# Altium project EVT_SYS_CARRIER_CI614.PrjPcb
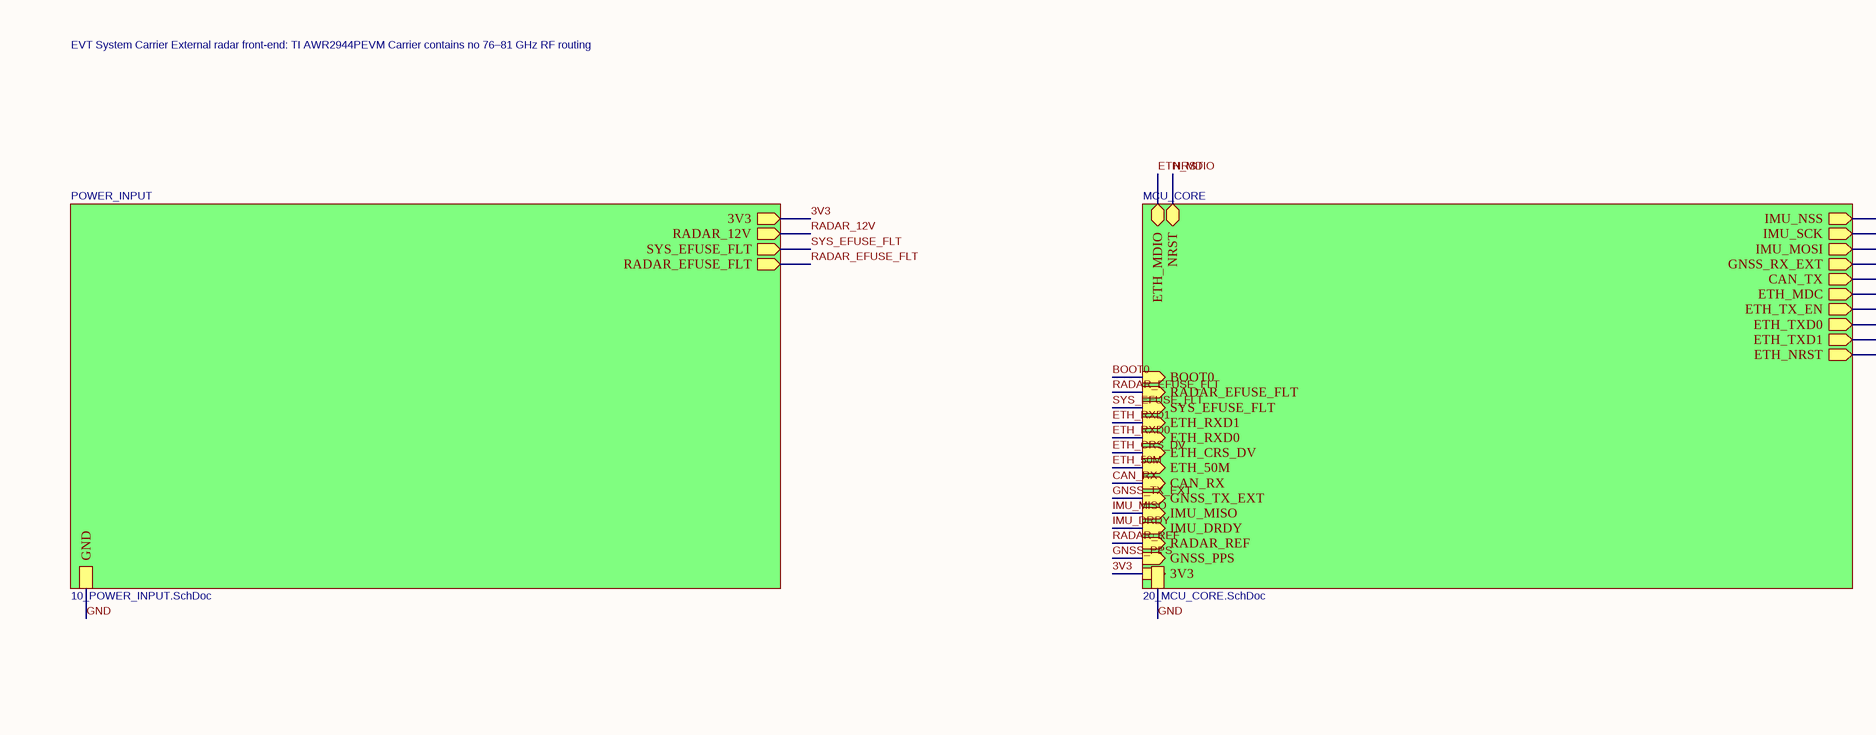
[diagram p0: EVT_SYS_CARRIER.SchDoc, top left]
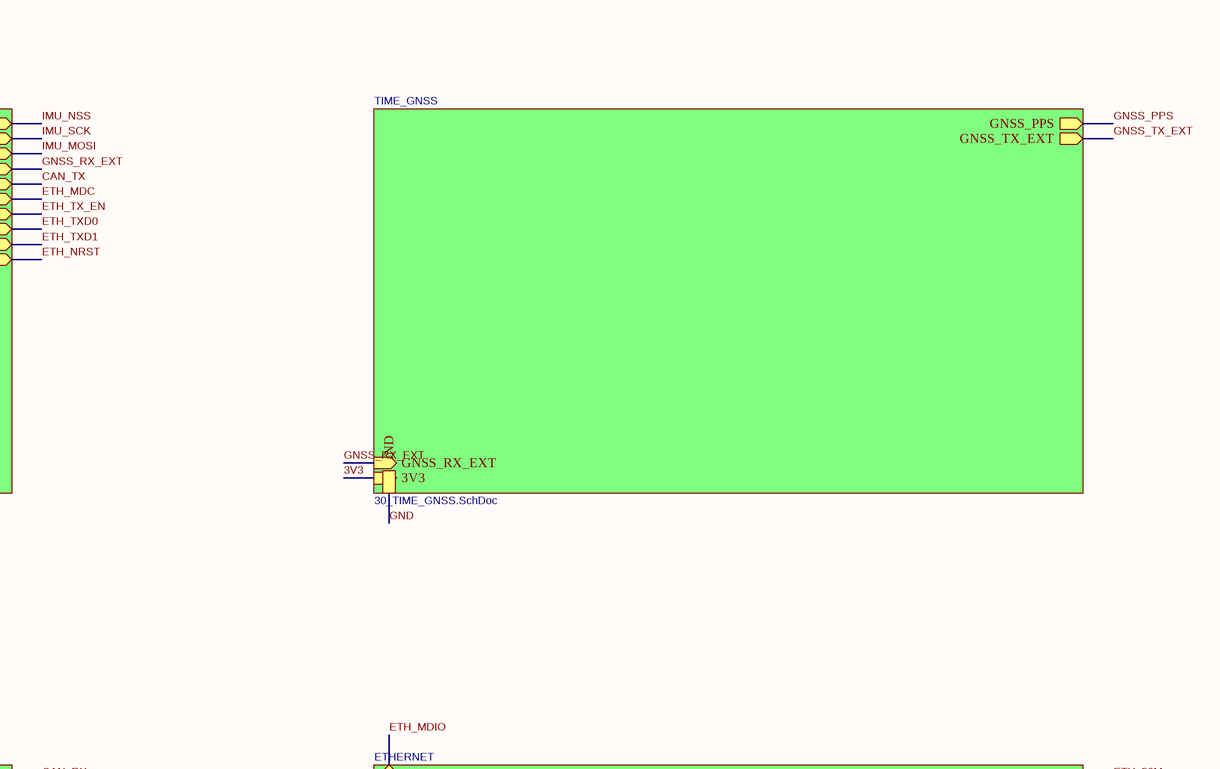
[diagram p1: EVT_SYS_CARRIER.SchDoc, top right]
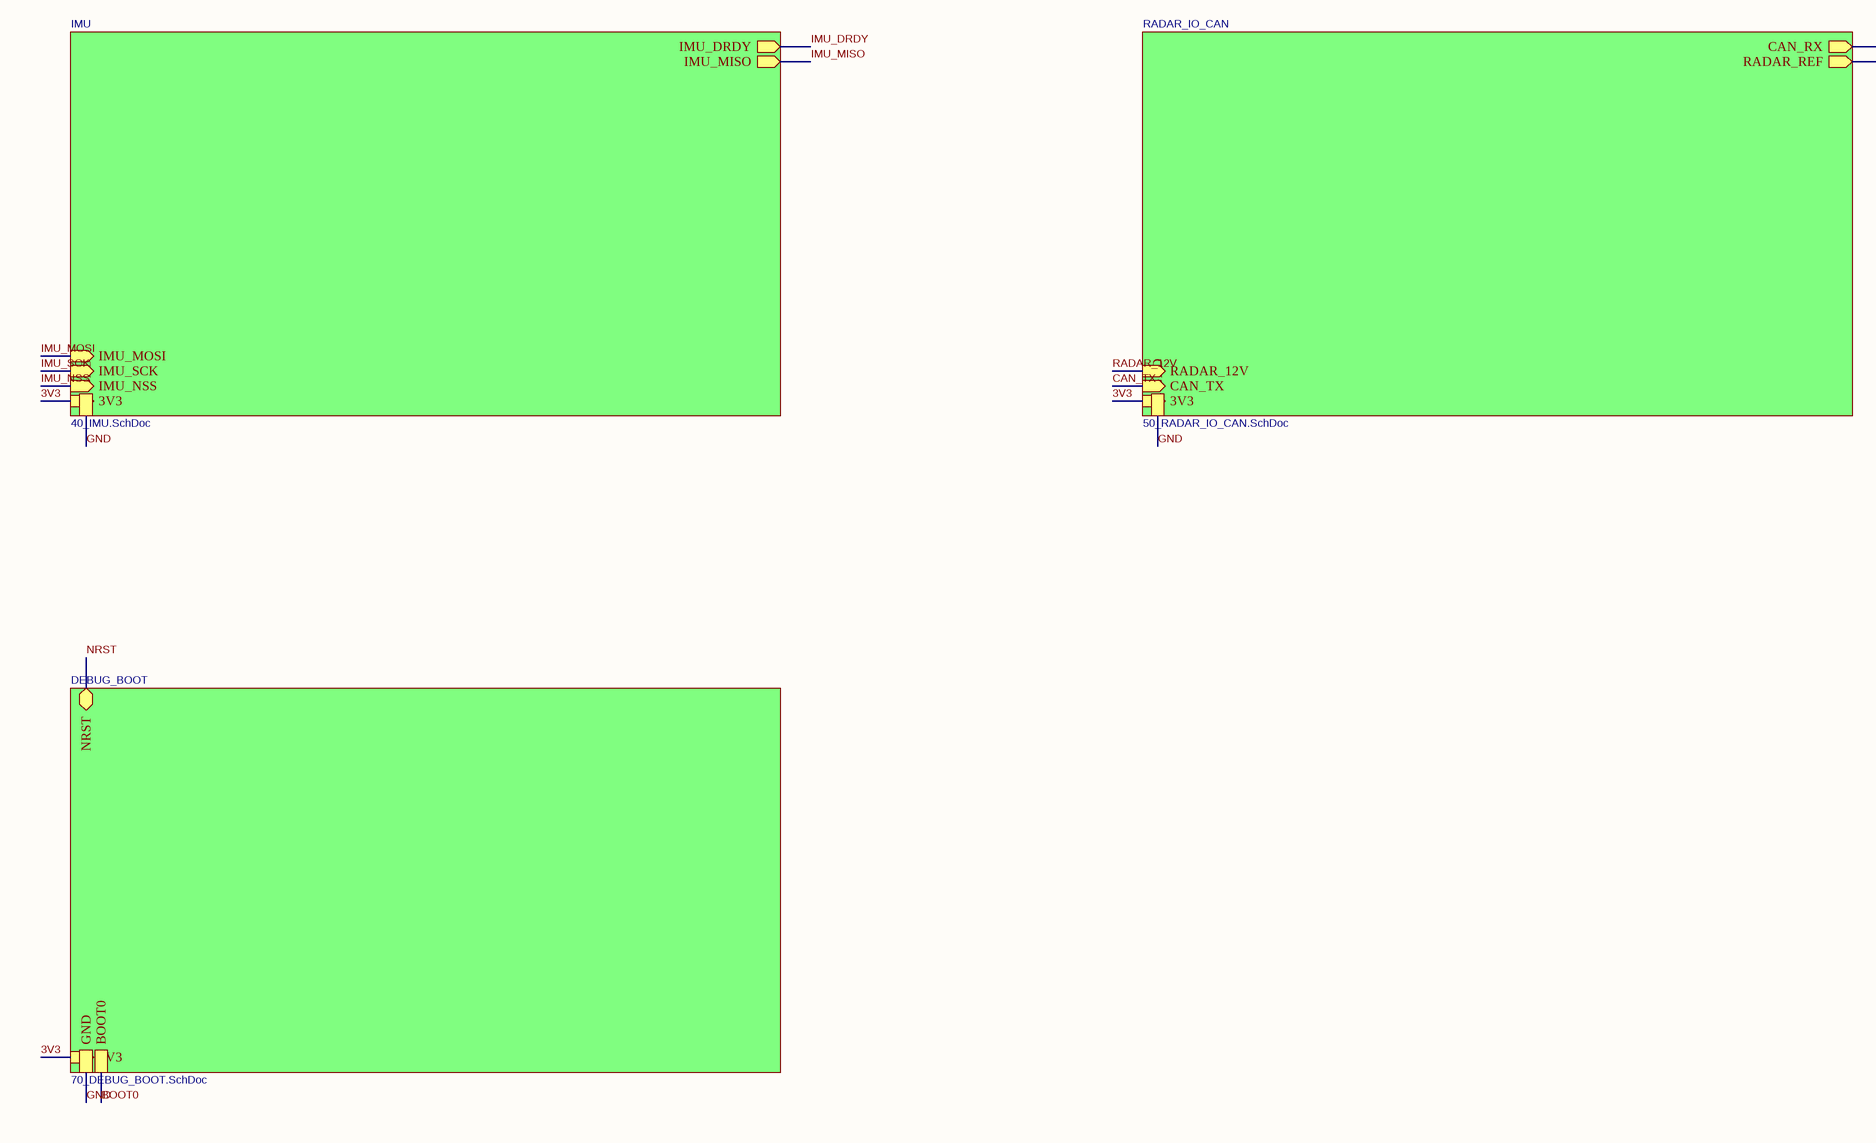
[diagram p2: EVT_SYS_CARRIER.SchDoc, bottom left]
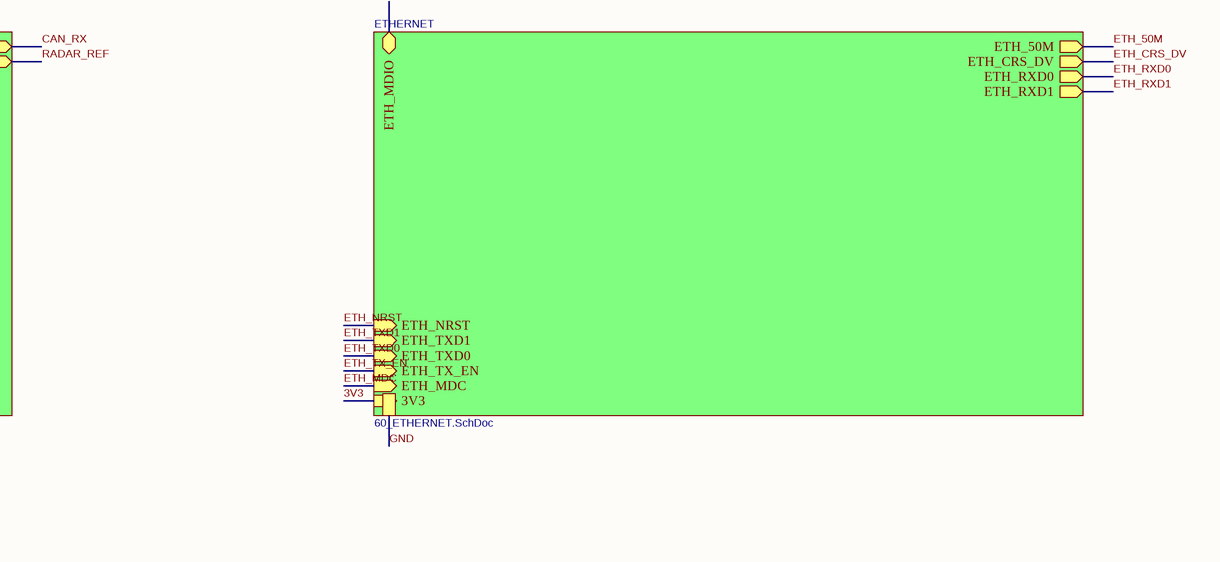
[diagram p3: EVT_SYS_CARRIER.SchDoc, bottom right]
8 sheets, 100 parts. Net scope: hierarchical (ports join the sheet entries above them; power ports are global).
Board file: EVT_SYS_CARRIER.PcbDoc
Sheets:
  EVT_SYS_CARRIER.SchDoc
    POWER_INPUT = 10_POWER_INPUT.SchDoc
    MCU_CORE = 20_MCU_CORE.SchDoc
    TIME_GNSS = 30_TIME_GNSS.SchDoc
    IMU = 40_IMU.SchDoc
    RADAR_IO_CAN = 50_RADAR_IO_CAN.SchDoc
    ETHERNET = 60_ETHERNET.SchDoc
    DEBUG_BOOT = 70_DEBUG_BOOT.SchDoc

## Sheet EVT_SYS_CARRIER.SchDoc
size 594 x 420 mm

### Sub-sheets
DEBUG_BOOT = 70_DEBUG_BOOT.SchDoc: 3V3 (in), GND, NRST (bidir), BOOT0
ETHERNET = 60_ETHERNET.SchDoc: 3V3 (in), GND, ETH_50M (out), ETH_MDIO (bidir), ETH_MDC (in), ETH_CRS_DV (out), ETH_RXD0 (out), ETH_RXD1 (out), ETH_TX_EN (in), ETH_TXD0 (in), ETH_TXD1 (in), ETH_NRST (in)
IMU = 40_IMU.SchDoc: 3V3 (in), GND, IMU_DRDY (out), IMU_NSS (in), IMU_SCK (in), IMU_MISO (out), IMU_MOSI (in)
MCU_CORE = 20_MCU_CORE.SchDoc: 3V3 (in), GND, GNSS_PPS (in), RADAR_REF (in), IMU_DRDY (in), IMU_NSS (out), IMU_SCK (out), IMU_MISO (in), IMU_MOSI (out), GNSS_RX_EXT (out), GNSS_TX_EXT (in), CAN_RX (in), CAN_TX (out), ETH_50M (in), ETH_MDIO (bidir), ETH_MDC (out), ETH_CRS_DV (in), ETH_RXD0 (in), ETH_RXD1 (in), ETH_TX_EN (out), ETH_TXD0 (out), ETH_TXD1 (out), ETH_NRST (out), SYS_EFUSE_FLT (in), RADAR_EFUSE_FLT (in), NRST (bidir), BOOT0 (in)
POWER_INPUT = 10_POWER_INPUT.SchDoc: 3V3 (out), RADAR_12V (out), SYS_EFUSE_FLT (out), RADAR_EFUSE_FLT (out), GND
RADAR_IO_CAN = 50_RADAR_IO_CAN.SchDoc: 3V3 (in), GND, CAN_TX (in), CAN_RX (out), RADAR_REF (out), RADAR_12V (in)
TIME_GNSS = 30_TIME_GNSS.SchDoc: 3V3 (in), GND, GNSS_PPS (out), GNSS_TX_EXT (out), GNSS_RX_EXT (in)

### Nets
3V3: sheet POWER_INPUT/3V3, sheet MCU_CORE/3V3, sheet TIME_GNSS/3V3, sheet IMU/3V3, sheet RADAR_IO_CAN/3V3, sheet ETHERNET/3V3, sheet DEBUG_BOOT/3V3
BOOT0: sheet MCU_CORE/BOOT0, sheet DEBUG_BOOT/BOOT0
CAN_RX: sheet MCU_CORE/CAN_RX, sheet RADAR_IO_CAN/CAN_RX
CAN_TX: sheet MCU_CORE/CAN_TX, sheet RADAR_IO_CAN/CAN_TX
ETH_50M: sheet MCU_CORE/ETH_50M, sheet ETHERNET/ETH_50M
ETH_CRS_DV: sheet MCU_CORE/ETH_CRS_DV, sheet ETHERNET/ETH_CRS_DV
ETH_MDC: sheet MCU_CORE/ETH_MDC, sheet ETHERNET/ETH_MDC
ETH_MDIO: sheet MCU_CORE/ETH_MDIO, sheet ETHERNET/ETH_MDIO
ETH_NRST: sheet MCU_CORE/ETH_NRST, sheet ETHERNET/ETH_NRST
ETH_RXD0: sheet MCU_CORE/ETH_RXD0, sheet ETHERNET/ETH_RXD0
ETH_RXD1: sheet MCU_CORE/ETH_RXD1, sheet ETHERNET/ETH_RXD1
ETH_TX_EN: sheet MCU_CORE/ETH_TX_EN, sheet ETHERNET/ETH_TX_EN
ETH_TXD0: sheet MCU_CORE/ETH_TXD0, sheet ETHERNET/ETH_TXD0
ETH_TXD1: sheet MCU_CORE/ETH_TXD1, sheet ETHERNET/ETH_TXD1
GND: sheet POWER_INPUT/GND, sheet MCU_CORE/GND, sheet TIME_GNSS/GND, sheet IMU/GND, sheet RADAR_IO_CAN/GND, sheet ETHERNET/GND, sheet DEBUG_BOOT/GND
GNSS_PPS: sheet MCU_CORE/GNSS_PPS, sheet TIME_GNSS/GNSS_PPS
GNSS_RX_EXT: sheet MCU_CORE/GNSS_RX_EXT, sheet TIME_GNSS/GNSS_RX_EXT
GNSS_TX_EXT: sheet MCU_CORE/GNSS_TX_EXT, sheet TIME_GNSS/GNSS_TX_EXT
IMU_DRDY: sheet MCU_CORE/IMU_DRDY, sheet IMU/IMU_DRDY
IMU_MISO: sheet MCU_CORE/IMU_MISO, sheet IMU/IMU_MISO
IMU_MOSI: sheet MCU_CORE/IMU_MOSI, sheet IMU/IMU_MOSI
IMU_NSS: sheet MCU_CORE/IMU_NSS, sheet IMU/IMU_NSS
IMU_SCK: sheet MCU_CORE/IMU_SCK, sheet IMU/IMU_SCK
NRST: sheet MCU_CORE/NRST, sheet DEBUG_BOOT/NRST
RADAR_12V: sheet POWER_INPUT/RADAR_12V, sheet RADAR_IO_CAN/RADAR_12V
RADAR_EFUSE_FLT: sheet POWER_INPUT/RADAR_EFUSE_FLT, sheet MCU_CORE/RADAR_EFUSE_FLT
RADAR_REF: sheet MCU_CORE/RADAR_REF, sheet RADAR_IO_CAN/RADAR_REF
SYS_EFUSE_FLT: sheet POWER_INPUT/SYS_EFUSE_FLT, sheet MCU_CORE/SYS_EFUSE_FLT

### Notes on the sheet
- EVT System Carrier
  External radar front-end: TI AWR2944PEVM
  Carrier contains no 76–81 GHz RF routing
- 1
- 2
- 3
- 4
- 5
- 6
- 7
- 8
- 9
- 10
- 11
- A
- B
- C
- D
- E
- F
- G
- H
- Title: EVT_SYS_CARRIER
- File: EVT_SYS_CARRIER.kicad_sch
- Sheet: /
- KiCad E.D.A.  kicad (5.1.4)-1
- Size: A2
- Date:
- Rev:
- Id: 1/1

## Sheet 10_POWER_INPUT.SchDoc
size 297 x 209 mm
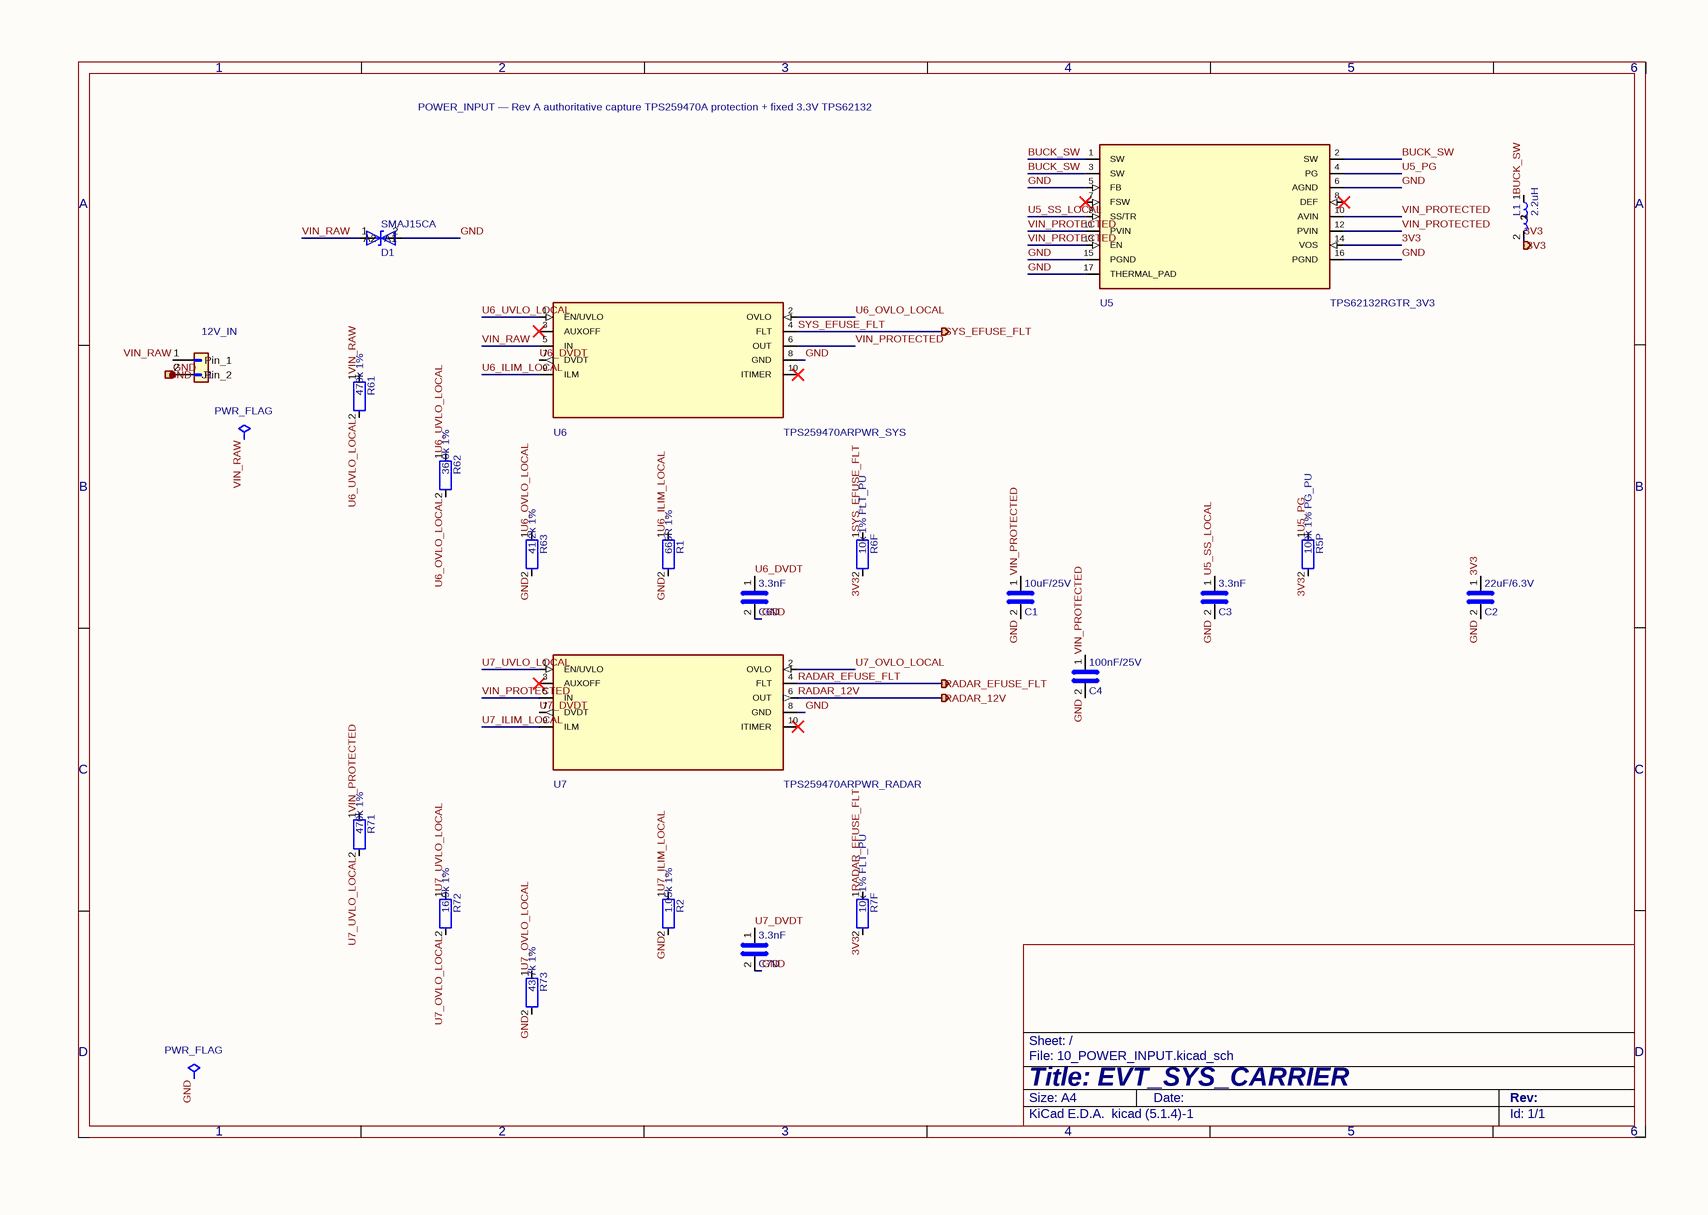
[diagram p4: 10_POWER_INPUT.SchDoc]

### Parts
#FLG0201  PWR_FLAG  (graphical)
#FLG0202  PWR_FLAG  (graphical)
C1  10uF/25V  [C_1206_3216Metric]
C2  22uF/6.3V  [C_1206_3216Metric]
C3  3.3nF  [C_0603_1608Metric]
C4  100nF/25V  [C_0603_1608Metric]
C6D  3.3nF  [C_0603_1608Metric]
C7D  3.3nF  [C_0603_1608Metric]
D1  SMAJ15CA  [D_SMA]
J1  12V_IN  [Molex_43650-0200_RA_THT_2P]
L1  2.2uH  [Coilcraft_XFL4020_4x4]
R1  665R 1%  [R_0603_1608Metric]
R2  1.05k 1%  [R_0603_1608Metric]
R5P  100k 1% PG_PU  [R_0603_1608Metric]
R6F  10k 1% FLT_PU  [R_0603_1608Metric]
R7F  10k 1% FLT_PU  [R_0603_1608Metric]
R61  470k 1%  [R_0603_1608Metric]
R62  36.0k 1%  [R_0603_1608Metric]
R63  41.2k 1%  [R_0603_1608Metric]
R71  470k 1%  [R_0603_1608Metric]
R72  16.9k 1%  [R_0603_1608Metric]
R73  43.7k 1%  [R_0603_1608Metric]
U5  TPS62132RGTR_3V3  [VQFN-16-1EP_3x3mm_P0.5mm_EP1.68x1.68mm]
U6  TPS259470ARPWR_SYS  [TPS259470A_RPW0010A_VQFN-HR-10_2x2mm_P0.475mm]
U7  TPS259470ARPWR_RADAR  [TPS259470A_RPW0010A_VQFN-HR-10_2x2mm_P0.475mm]

### Ports
3V3 (out), GND, RADAR_12V (out), RADAR_EFUSE_FLT (out), SYS_EFUSE_FLT (out)

### Nets
3V3: C2.1 L1.2 R5P.2 R6F.2 R7F.2 U5.14(VOS) ; port 3V3
BUCK_SW: L1.1 U5.1(SW) U5.2(SW) U5.3(SW)
GND: #FLG0202.1 C1.2 C2.2 C3.2 C4.2 C6D.2 C7D.2 D1.2(A2) J1.2(Pin_2) R1.2 R2.2 R63.2 R73.2 U5.5(FB) U5.6(AGND) U5.15(PGND) U5.16(PGND) U5.17(THERMAL_PAD) U6.8(GND) U7.8(GND) ; port GND
RADAR_12V: U7.6(OUT) ; port RADAR_12V
RADAR_EFUSE_FLT: R7F.1 U7.4(FLT) ; port RADAR_EFUSE_FLT
SYS_EFUSE_FLT: R6F.1 U6.4(FLT) ; port SYS_EFUSE_FLT
U5_PG: R5P.1 U5.4(PG)
U5_SS_LOCAL: C3.1 U5.9(SS/TR)
U6_DVDT: C6D.1 U6.7(DVDT)
U6_ILIM_LOCAL: R1.1 U6.9(ILM)
U6_OVLO_LOCAL: R62.2 R63.1 U6.2(OVLO)
U6_UVLO_LOCAL: R61.2 R62.1 U6.1(EN/UVLO)
U7_DVDT: C7D.1 U7.7(DVDT)
U7_ILIM_LOCAL: R2.1 U7.9(ILM)
U7_OVLO_LOCAL: R72.2 R73.1 U7.2(OVLO)
U7_UVLO_LOCAL: R71.2 R72.1 U7.1(EN/UVLO)
VIN_PROTECTED: C1.1 C4.1 R71.1 U5.10(AVIN) U5.11(PVIN) U5.12(PVIN) U5.13(EN) U6.6(OUT) U7.5(IN)
VIN_RAW: #FLG0201.1 D1.1(A1) J1.1(Pin_1) R61.1 U6.5(IN)

Not connected (* = marked no-connect by the designer): U5 7(FSW)* 8(DEF)*; U6 3(AUXOFF)* 10(ITIMER)*; U7 3(AUXOFF)* 10(ITIMER)*

### Notes on the sheet
- POWER_INPUT — Rev A authoritative capture
  TPS259470A protection + fixed 3.3V TPS62132
- 1
- 2
- 3
- 4
- 5
- 6
- A
- B
- C
- D
- Title: EVT_SYS_CARRIER
- File: 10_POWER_INPUT.kicad_sch
- Sheet: /
- KiCad E.D.A.  kicad (5.1.4)-1
- Size: A4
- Date:
- Rev:
- Id: 1/1

### Library data of the parts
#FLG0201 #FLG0202 = PWR_FLAG: hierarchy_path: /6b16e5b2-f68a-4a25-ac1d-30b3be7dfe00/26a33be1-548c-4698-a3f3-a2473fb4ee95; Value: PWR_FLAG
C1 = C: MPN: 10uF_25V_X7R; hierarchy_path: /6b16e5b2-f68a-4a25-ac1d-30b3be7dfe00/26a33be1-548c-4698-a3f3-a2473fb4ee95; Value: 10uF/25V; Footprint: Capacitor_SMD:C_1206_3216Metric
C2 = C: MPN: 22uF_6.3V_X7R; hierarchy_path: /6b16e5b2-f68a-4a25-ac1d-30b3be7dfe00/26a33be1-548c-4698-a3f3-a2473fb4ee95; Value: 22uF/6.3V; Footprint: Capacitor_SMD:C_1206_3216Metric
C3 C6D C7D = C: MPN: 3.3nF_X7R; hierarchy_path: /6b16e5b2-f68a-4a25-ac1d-30b3be7dfe00/26a33be1-548c-4698-a3f3-a2473fb4ee95; Value: 3.3nF; Footprint: Capacitor_SMD:C_0603_1608Metric
C4 = C: MPN: 100nF_25V_X7R; hierarchy_path: /6b16e5b2-f68a-4a25-ac1d-30b3be7dfe00/26a33be1-548c-4698-a3f3-a2473fb4ee95; Value: 100nF/25V; Footprint: Capacitor_SMD:C_0603_1608Metric
D1 = D_TVS: hierarchy_path: /6b16e5b2-f68a-4a25-ac1d-30b3be7dfe00/26a33be1-548c-4698-a3f3-a2473fb4ee95; MPN: SMAJ15CA; Value: SMAJ15CA; Footprint: Diode_SMD:D_SMA
J1 = Conn_01x02: MPN: 43650-0200; hierarchy_path: /6b16e5b2-f68a-4a25-ac1d-30b3be7dfe00/26a33be1-548c-4698-a3f3-a2473fb4ee95; Value: 12V_IN; Footprint: SystemCarrier_Altium:Molex_43650-0200_RA_THT_2P
L1 = L: MPN: XFL4020-222MEC; hierarchy_path: /6b16e5b2-f68a-4a25-ac1d-30b3be7dfe00/26a33be1-548c-4698-a3f3-a2473fb4ee95; Value: 2.2uH; Footprint: SystemCarrier_Altium:Coilcraft_XFL4020_4x4
R1 = R: MPN: 665R_1%; hierarchy_path: /6b16e5b2-f68a-4a25-ac1d-30b3be7dfe00/26a33be1-548c-4698-a3f3-a2473fb4ee95; Value: 665R 1%; Footprint: Resistor_SMD:R_0603_1608Metric
R2 = R: MPN: 1.05k_1%; hierarchy_path: /6b16e5b2-f68a-4a25-ac1d-30b3be7dfe00/26a33be1-548c-4698-a3f3-a2473fb4ee95; Value: 1.05k 1%; Footprint: Resistor_SMD:R_0603_1608Metric
R5P = R: MPN: 100k_1%; hierarchy_path: /6b16e5b2-f68a-4a25-ac1d-30b3be7dfe00/26a33be1-548c-4698-a3f3-a2473fb4ee95; Value: 100k 1% PG_PU; Footprint: Resistor_SMD:R_0603_1608Metric
R6F R7F = R: MPN: 10k_1%; hierarchy_path: /6b16e5b2-f68a-4a25-ac1d-30b3be7dfe00/26a33be1-548c-4698-a3f3-a2473fb4ee95; Value: 10k 1% FLT_PU; Footprint: Resistor_SMD:R_0603_1608Metric
R61 R71 = R: MPN: 470k_1%; hierarchy_path: /6b16e5b2-f68a-4a25-ac1d-30b3be7dfe00/26a33be1-548c-4698-a3f3-a2473fb4ee95; Value: 470k 1%; Footprint: Resistor_SMD:R_0603_1608Metric
R62 = R: MPN: 36.0k_1%; hierarchy_path: /6b16e5b2-f68a-4a25-ac1d-30b3be7dfe00/26a33be1-548c-4698-a3f3-a2473fb4ee95; Value: 36.0k 1%; Footprint: Resistor_SMD:R_0603_1608Metric
R63 = R: MPN: 41.2k_1%; hierarchy_path: /6b16e5b2-f68a-4a25-ac1d-30b3be7dfe00/26a33be1-548c-4698-a3f3-a2473fb4ee95; Value: 41.2k 1%; Footprint: Resistor_SMD:R_0603_1608Metric
R72 = R: MPN: 16.9k_1%; hierarchy_path: /6b16e5b2-f68a-4a25-ac1d-30b3be7dfe00/26a33be1-548c-4698-a3f3-a2473fb4ee95; Value: 16.9k 1%; Footprint: Resistor_SMD:R_0603_1608Metric
R73 = R: MPN: 43.7k_1%; hierarchy_path: /6b16e5b2-f68a-4a25-ac1d-30b3be7dfe00/26a33be1-548c-4698-a3f3-a2473fb4ee95; Value: 43.7k 1%; Footprint: Resistor_SMD:R_0603_1608Metric
U5 = TPS62132RGTR: Capture_Status: LOCAL_CONTRACT_SYMBOL; hierarchy_path: /6b16e5b2-f68a-4a25-ac1d-30b3be7dfe00/26a33be1-548c-4698-a3f3-a2473fb4ee95; MPN: TPS62132RGTR; Value: TPS62132RGTR_3V3; Footprint: Package_DFN_QFN:VQFN-16-1EP_3x3mm_P0.5mm_EP1.68x1.68mm
U6 U7 = TPS259470ARPWR: Capture_Status: LOCAL_CONTRACT_SYMBOL; hierarchy_path: /6b16e5b2-f68a-4a25-ac1d-30b3be7dfe00/26a33be1-548c-4698-a3f3-a2473fb4ee95; MPN: TPS259470ARPWR; Footprint: SystemCarrier_Local:TPS259470A_RPW0010A_VQFN-HR-10_2x2mm_P0.475mm
  U6: Value: TPS259470ARPWR_SYS
  U7: Value: TPS259470ARPWR_RADAR

## Sheet 20_MCU_CORE.SchDoc
size 420 x 297 mm
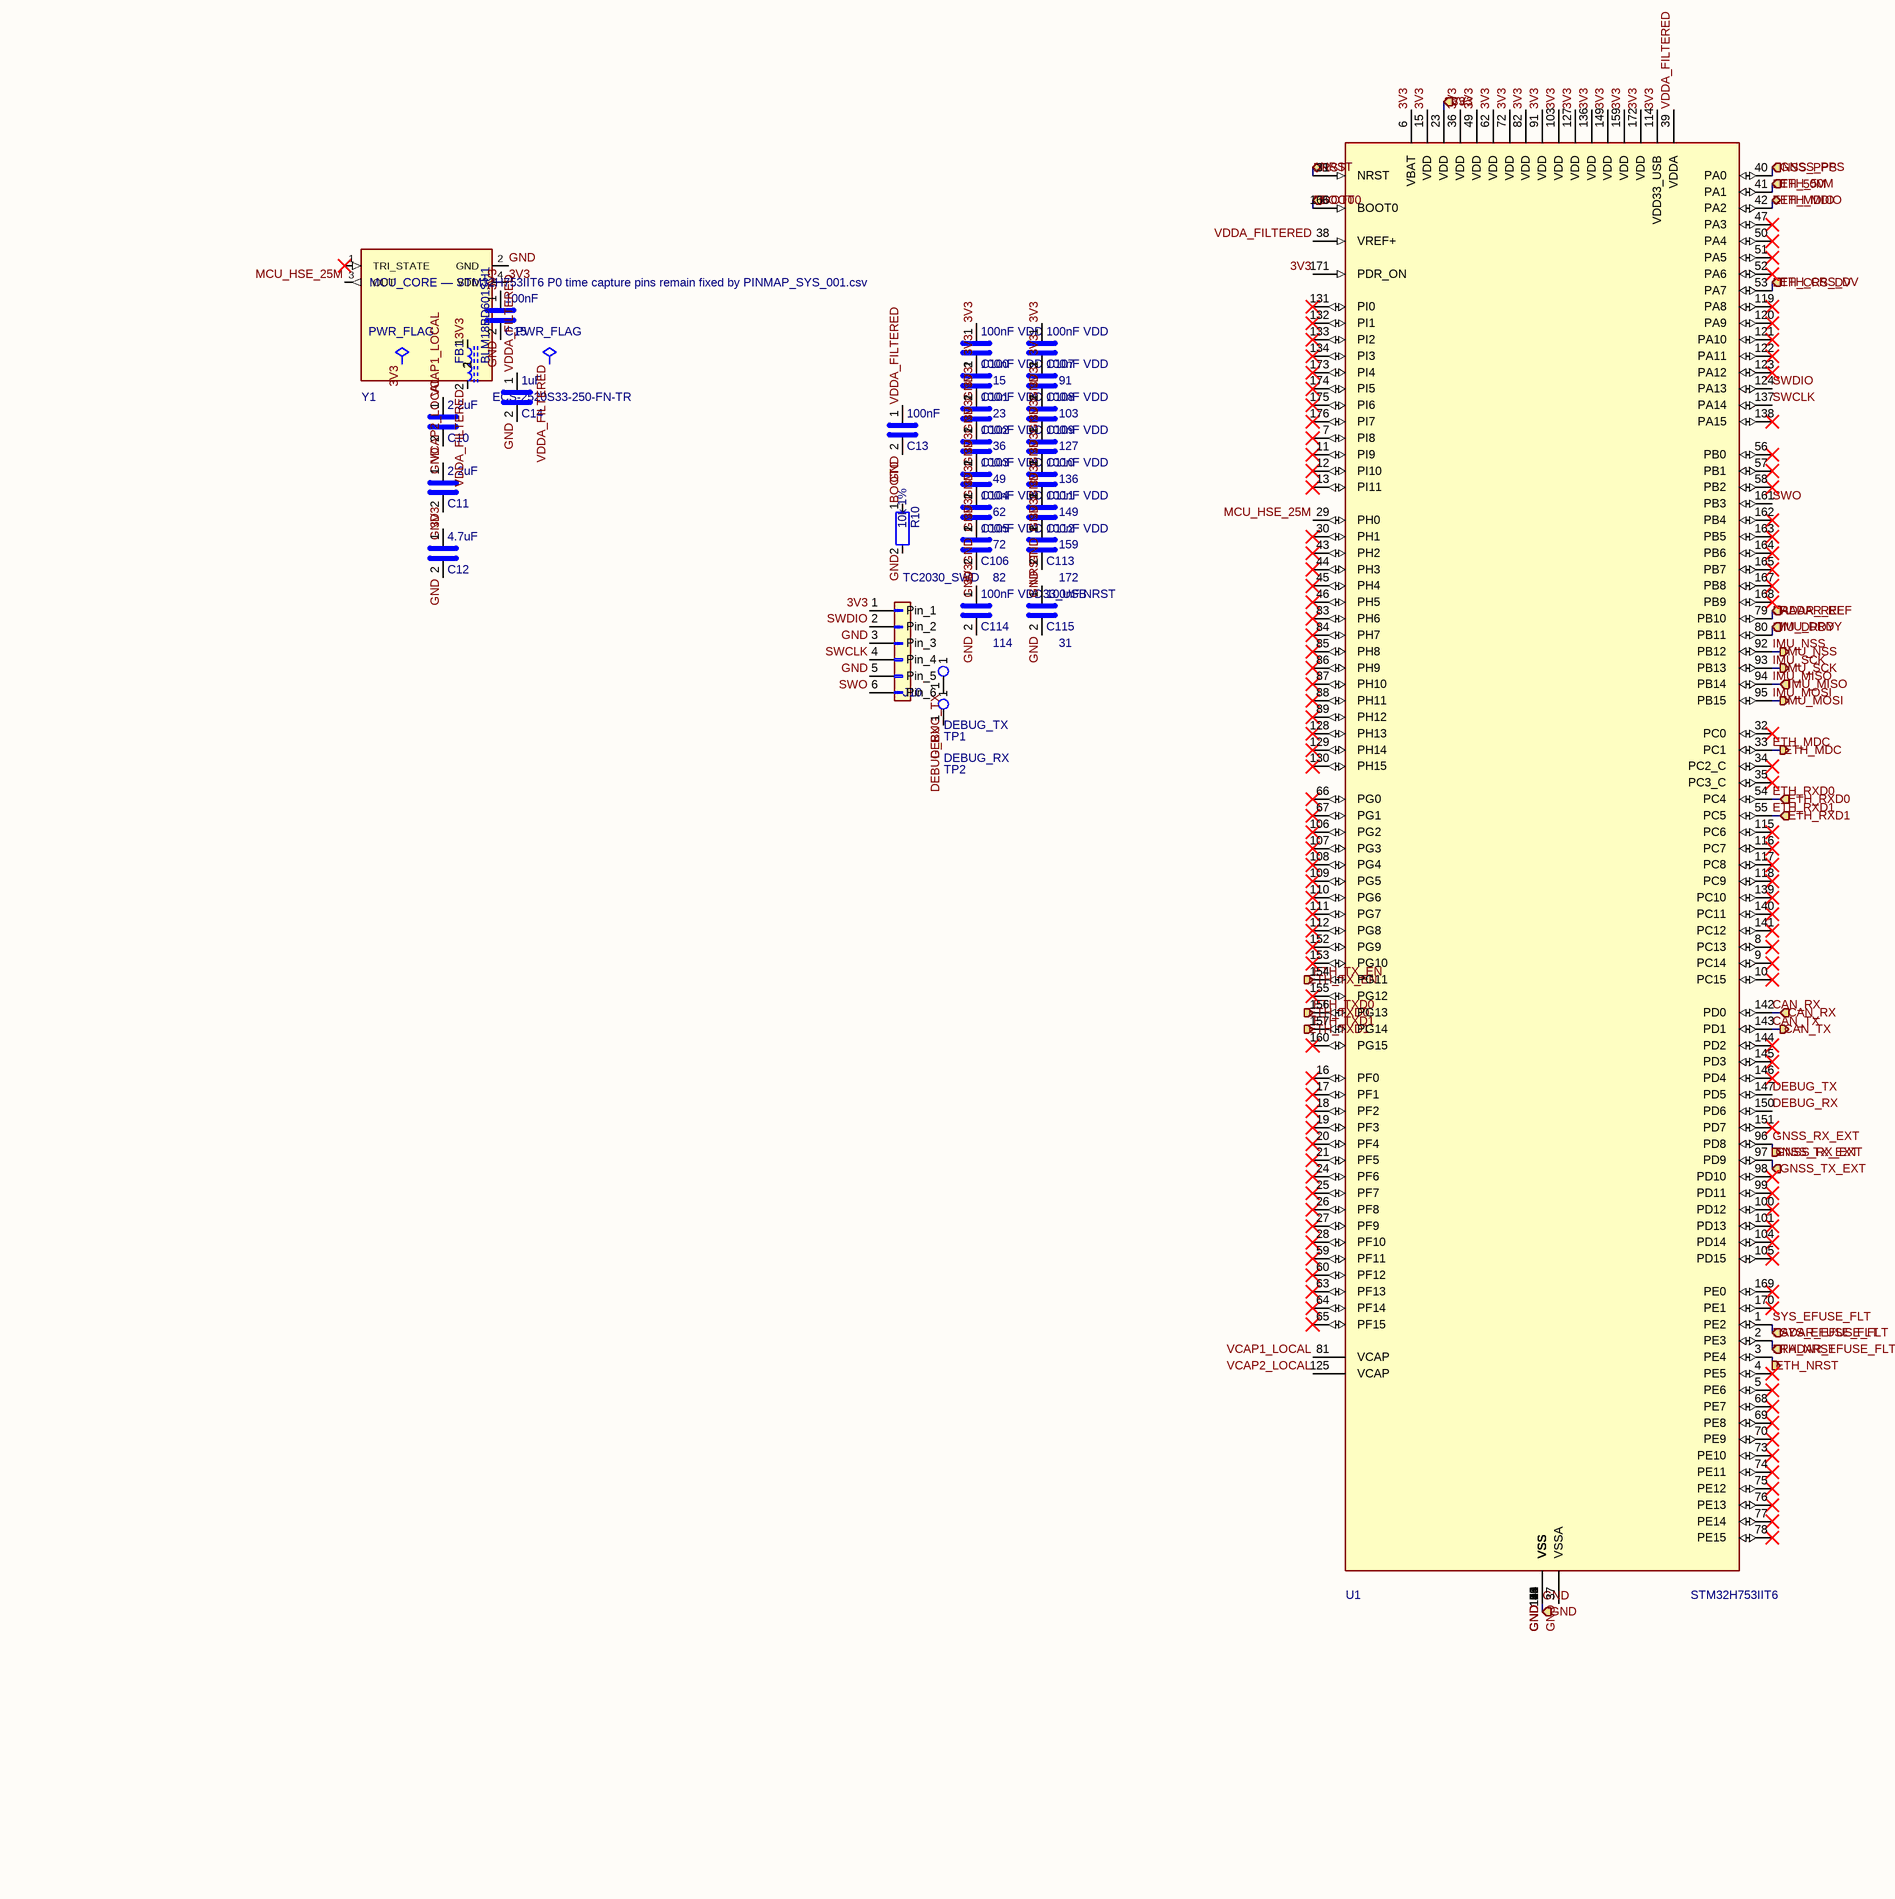
[diagram p5: 20_MCU_CORE.SchDoc]

### Parts
#FLG0101  PWR_FLAG  (graphical)
#FLG0103  PWR_FLAG  (graphical)
C10  2.2uF  [C_0603_1608Metric]
C11  2.2uF  [C_0603_1608Metric]
C12  4.7uF  [C_0805_2012Metric]
C13  100nF  [C_0402_1005Metric]
C14  1uF  [C_0603_1608Metric]
C15  100nF  [C_0402_1005Metric]
C100  Decouples_U1_Pin: 15  [C_0402_1005Metric]  (hidden comment: 100nF VDD)
C101  Decouples_U1_Pin: 23  [C_0402_1005Metric]  (hidden comment: 100nF VDD)
C102  Decouples_U1_Pin: 36  [C_0402_1005Metric]  (hidden comment: 100nF VDD)
C103  Decouples_U1_Pin: 49  [C_0402_1005Metric]  (hidden comment: 100nF VDD)
C104  Decouples_U1_Pin: 62  [C_0402_1005Metric]  (hidden comment: 100nF VDD)
C105  Decouples_U1_Pin: 72  [C_0402_1005Metric]  (hidden comment: 100nF VDD)
C106  Decouples_U1_Pin: 82  [C_0402_1005Metric]  (hidden comment: 100nF VDD)
C107  Decouples_U1_Pin: 91  [C_0402_1005Metric]  (hidden comment: 100nF VDD)
C108  Decouples_U1_Pin: 103  [C_0402_1005Metric]  (hidden comment: 100nF VDD)
C109  Decouples_U1_Pin: 127  [C_0402_1005Metric]  (hidden comment: 100nF VDD)
C110  Decouples_U1_Pin: 136  [C_0402_1005Metric]  (hidden comment: 100nF VDD)
C111  Decouples_U1_Pin: 149  [C_0402_1005Metric]  (hidden comment: 100nF VDD)
C112  Decouples_U1_Pin: 159  [C_0402_1005Metric]  (hidden comment: 100nF VDD)
C113  Decouples_U1_Pin: 172  [C_0402_1005Metric]  (hidden comment: 100nF VDD)
C114  Decouples_U1_Pin: 114  [C_0402_1005Metric]  (hidden comment: 100nF VDD33_USB)
C115  Filters_U1_Pin: 31  [C_0402_1005Metric]  (hidden comment: 100nF NRST)
FB1  BLM18BD601SH1  [L_0603_1608Metric]
J10  TC2030_SWD  [TagConnect_TC2030_NL]
R10  10k 1%  [R_0603_1608Metric]
TP1  DEBUG_TX  [TestPoint_Pad_D1.0mm]
TP2  DEBUG_RX  [TestPoint_Pad_D1.0mm]
U1  STM32H753IIT6  [LQFP-176_24x24mm_P0.5mm]
Y1  ECS-2520S33-250-FN-TR  [Oscillator_SMD_ECS_2520MV-xxx-xx-4Pin_2.5x2.0mm]

### Ports
3V3 (in), BOOT0 (in), CAN_RX (in), CAN_TX (out), ETH_50M (in), ETH_CRS_DV (in), ETH_MDC (out), ETH_MDIO (bidir), ETH_NRST (out), ETH_RXD0 (in), ETH_RXD1 (in), ETH_TX_EN (out), ETH_TXD0 (out), ETH_TXD1 (out), GND, GNSS_PPS (in), GNSS_RX_EXT (out), GNSS_TX_EXT (in), IMU_DRDY (in), IMU_MISO (in), IMU_MOSI (out), IMU_NSS (out), IMU_SCK (out), NRST (bidir), RADAR_EFUSE_FLT (in), RADAR_REF (in), SYS_EFUSE_FLT (in)

### Nets
3V3: #FLG0101.1 C12.1 C15.1 C100.1 C101.1 C102.1 C103.1 C104.1 C105.1 C106.1 C107.1 C108.1 C109.1 C110.1 C111.1 C112.1 C113.1 C114.1 FB1.1 J10.1(Pin_1) U1.6(VBAT) U1.15(VDD) U1.23(VDD) U1.36(VDD) U1.49(VDD) U1.62(VDD) U1.72(VDD) U1.82(VDD) U1.91(VDD) U1.103(VDD) U1.114(VDD33_USB) U1.127(VDD) U1.136(VDD) U1.149(VDD) U1.159(VDD) U1.171(PDR_ON) U1.172(VDD) Y1.4(VDD) ; port 3V3
BOOT0: R10.1 U1.166(BOOT0) ; port BOOT0
CAN_RX: U1.142(PD0) ; port CAN_RX
CAN_TX: U1.143(PD1) ; port CAN_TX
DEBUG_RX: TP2.1 U1.150(PD6)
DEBUG_TX: TP1.1 U1.147(PD5)
ETH_50M: U1.41(PA1) ; port ETH_50M
ETH_CRS_DV: U1.53(PA7) ; port ETH_CRS_DV
ETH_MDC: U1.33(PC1) ; port ETH_MDC
ETH_MDIO: U1.42(PA2) ; port ETH_MDIO
ETH_NRST: U1.3(PE4) ; port ETH_NRST
ETH_RXD0: U1.54(PC4) ; port ETH_RXD0
ETH_RXD1: U1.55(PC5) ; port ETH_RXD1
ETH_TX_EN: U1.154(PG11) ; port ETH_TX_EN
ETH_TXD0: U1.156(PG13) ; port ETH_TXD0
ETH_TXD1: U1.157(PG14) ; port ETH_TXD1
GND: C10.2 C11.2 C12.2 C13.2 C14.2 C15.2 C100.2 C101.2 C102.2 C103.2 C104.2 C105.2 C106.2 C107.2 C108.2 C109.2 C110.2 C111.2 C112.2 C113.2 C114.2 C115.2 J10.3(Pin_3) J10.5(Pin_5) R10.2 U1.14(VSS) U1.22(VSS) U1.37(VSSA) U1.48(VSS) U1.61(VSS) U1.71(VSS) U1.90(VSS) U1.102(VSS) U1.113(VSS) U1.126(VSS) U1.135(VSS) U1.148(VSS) U1.158(VSS) Y1.2(GND) ; port GND
GNSS_PPS: U1.40(PA0) ; port GNSS_PPS
GNSS_RX_EXT: U1.96(PD8) ; port GNSS_RX_EXT
GNSS_TX_EXT: U1.97(PD9) ; port GNSS_TX_EXT
IMU_DRDY: U1.80(PB11) ; port IMU_DRDY
IMU_MISO: U1.94(PB14) ; port IMU_MISO
IMU_MOSI: U1.95(PB15) ; port IMU_MOSI
IMU_NSS: U1.92(PB12) ; port IMU_NSS
IMU_SCK: U1.93(PB13) ; port IMU_SCK
MCU_HSE_25M: U1.29(PH0) Y1.3(OUT)
NRST: C115.1 U1.31(NRST) ; port NRST
RADAR_EFUSE_FLT: U1.2(PE3) ; port RADAR_EFUSE_FLT
RADAR_REF: U1.79(PB10) ; port RADAR_REF
SWCLK: J10.4(Pin_4) U1.137(PA14)
SWDIO: J10.2(Pin_2) U1.124(PA13)
SWO: J10.6(Pin_6) U1.161(PB3)
SYS_EFUSE_FLT: U1.1(PE2) ; port SYS_EFUSE_FLT
VCAP1_LOCAL: C10.1 U1.81(VCAP)
VCAP2_LOCAL: C11.1 U1.125(VCAP)
VDDA_FILTERED: #FLG0103.1 C13.1 C14.1 FB1.2 U1.38(VREF+) U1.39(VDDA)

Not connected (* = marked no-connect by the designer): U1 4(PE5)* 5(PE6)* 7(PI8)* 8(PC13)* 9(PC14)* 10(PC15)* 11(PI9)* 12(PI10)* 13(PI11)* 16(PF0)* 17(PF1)* 18(PF2)* 19(PF3)* 20(PF4)* 21(PF5)* 24(PF6)* 25(PF7)* 26(PF8)* 27(PF9)* 28(PF10)* 30(PH1)* 32(PC0)* 34(PC2_C)* 35(PC3_C)* 43(PH2)* 44(PH3)* 45(PH4)* 46(PH5)* 47(PA3)* 50(PA4)* 51(PA5)* 52(PA6)* 56(PB0)* 57(PB1)* 58(PB2)* 59(PF11)* 60(PF12)* 63(PF13)* 64(PF14)* 65(PF15)* 66(PG0)* 67(PG1)* 68(PE7)* 69(PE8)* 70(PE9)* 73(PE10)* 74(PE11)* 75(PE12)* 76(PE13)* 77(PE14)* 78(PE15)* 83(PH6)* 84(PH7)* 85(PH8)* 86(PH9)* 87(PH10)* 88(PH11)* 89(PH12)* 98(PD10)* 99(PD11)* 100(PD12)* 101(PD13)* 104(PD14)* 105(PD15)* 106(PG2)* 107(PG3)* 108(PG4)* 109(PG5)* 110(PG6)* 111(PG7)* 112(PG8)* 115(PC6)* 116(PC7)* 117(PC8)* 118(PC9)* 119(PA8)* 120(PA9)* 121(PA10)* 122(PA11)* 123(PA12)* 128(PH13)* 129(PH14)* 130(PH15)* 131(PI0)* 132(PI1)* 133(PI2)* 134(PI3)* 138(PA15)* 139(PC10)* 140(PC11)* 141(PC12)* 144(PD2)* 145(PD3)* 146(PD4)* 151(PD7)* 152(PG9)* 153(PG10)* 155(PG12)* 160(PG15)* 162(PB4)* 163(PB5)* 164(PB6)* 165(PB7)* 167(PB8)* 168(PB9)* 169(PE0)* 170(PE1)* 173(PI4)* 174(PI5)* 175(PI6)* 176(PI7)*; Y1 1(TRI_STATE)*

### Notes on the sheet
- (near Y1) MCU_CORE — STM32H753IIT6
  P0 time capture pins remain fixed by PINMAP_SYS_001.csv
- 1
- 2
- 3
- 4
- 5
- 6
- 7
- 8
- A
- B
- C
- D
- E
- Title: EVT_SYS_CARRIER
- File: 20_MCU_CORE.kicad_sch
- Sheet: /
- F
- KiCad E.D.A.  kicad (5.1.4)-1
- Size: A3
- Date:
- Rev:
- Id: 1/1

### Library data of the parts
#FLG0101 #FLG0103 = PWR_FLAG: hierarchy_path: /6b16e5b2-f68a-4a25-ac1d-30b3be7dfe00/b7bcc1c8-0bf9-47fd-9db7-c9434a9326a0; Value: PWR_FLAG
C10 C11 = C: MPN: 2.2uF_6.3V_X7R; hierarchy_path: /6b16e5b2-f68a-4a25-ac1d-30b3be7dfe00/b7bcc1c8-0bf9-47fd-9db7-c9434a9326a0; Value: 2.2uF; Footprint: Capacitor_SMD:C_0603_1608Metric
C12 = C: MPN: 4.7uF_6.3V_X7R; hierarchy_path: /6b16e5b2-f68a-4a25-ac1d-30b3be7dfe00/b7bcc1c8-0bf9-47fd-9db7-c9434a9326a0; Value: 4.7uF; Footprint: Capacitor_SMD:C_0805_2012Metric
C13 C15 C100-C115 = C: MPN: 100nF_6.3V_X7R; hierarchy_path: /6b16e5b2-f68a-4a25-ac1d-30b3be7dfe00/b7bcc1c8-0bf9-47fd-9db7-c9434a9326a0; Footprint: Capacitor_SMD:C_0402_1005Metric
  C13 C15: Value: 100nF
  C100-C113: Value: 100nF VDD
  C114: Value: 100nF VDD33_USB
  C115: Value: 100nF NRST
C14 = C: MPN: 1uF_6.3V_X7R; hierarchy_path: /6b16e5b2-f68a-4a25-ac1d-30b3be7dfe00/b7bcc1c8-0bf9-47fd-9db7-c9434a9326a0; Value: 1uF; Footprint: Capacitor_SMD:C_0603_1608Metric
FB1 = L_Ferrite: hierarchy_path: /6b16e5b2-f68a-4a25-ac1d-30b3be7dfe00/b7bcc1c8-0bf9-47fd-9db7-c9434a9326a0; MPN: BLM18BD601SH1; Value: BLM18BD601SH1; Footprint: Inductor_SMD:L_0603_1608Metric
J10 = Conn_01x06: MPN: TC2030-NL_TARGET; hierarchy_path: /6b16e5b2-f68a-4a25-ac1d-30b3be7dfe00/b7bcc1c8-0bf9-47fd-9db7-c9434a9326a0; Value: TC2030_SWD; Footprint: SystemCarrier_Altium:TagConnect_TC2030_NL
R10 = R: MPN: 10k_1%; hierarchy_path: /6b16e5b2-f68a-4a25-ac1d-30b3be7dfe00/b7bcc1c8-0bf9-47fd-9db7-c9434a9326a0; Value: 10k 1%; Footprint: Resistor_SMD:R_0603_1608Metric
TP1 TP2 = TestPoint: hierarchy_path: /6b16e5b2-f68a-4a25-ac1d-30b3be7dfe00/b7bcc1c8-0bf9-47fd-9db7-c9434a9326a0; Footprint: TestPoint:TestPoint_Pad_D1.0mm
  TP1: MPN: DEBUG_TX; Value: DEBUG_TX
  TP2: MPN: DEBUG_RX; Value: DEBUG_RX
U1 = STM32H753IITx: hierarchy_path: /6b16e5b2-f68a-4a25-ac1d-30b3be7dfe00/b7bcc1c8-0bf9-47fd-9db7-c9434a9326a0; MPN: STM32H753IIT6; Value: STM32H753IIT6; Footprint: Package_QFP:LQFP-176_24x24mm_P0.5mm
Y1 = ECS-2520S33-250-FN-TR: Capture_Status: LOCAL_CONTRACT_SYMBOL; hierarchy_path: /6b16e5b2-f68a-4a25-ac1d-30b3be7dfe00/b7bcc1c8-0bf9-47fd-9db7-c9434a9326a0; MPN: ECS-2520S33-250-FN-TR; Value: ECS-2520S33-250-FN-TR; Footprint: Oscillator:Oscillator_SMD_ECS_2520MV-xxx-xx-4Pin_2.5x2.0mm

## Sheet 30_TIME_GNSS.SchDoc
size 297 x 209 mm
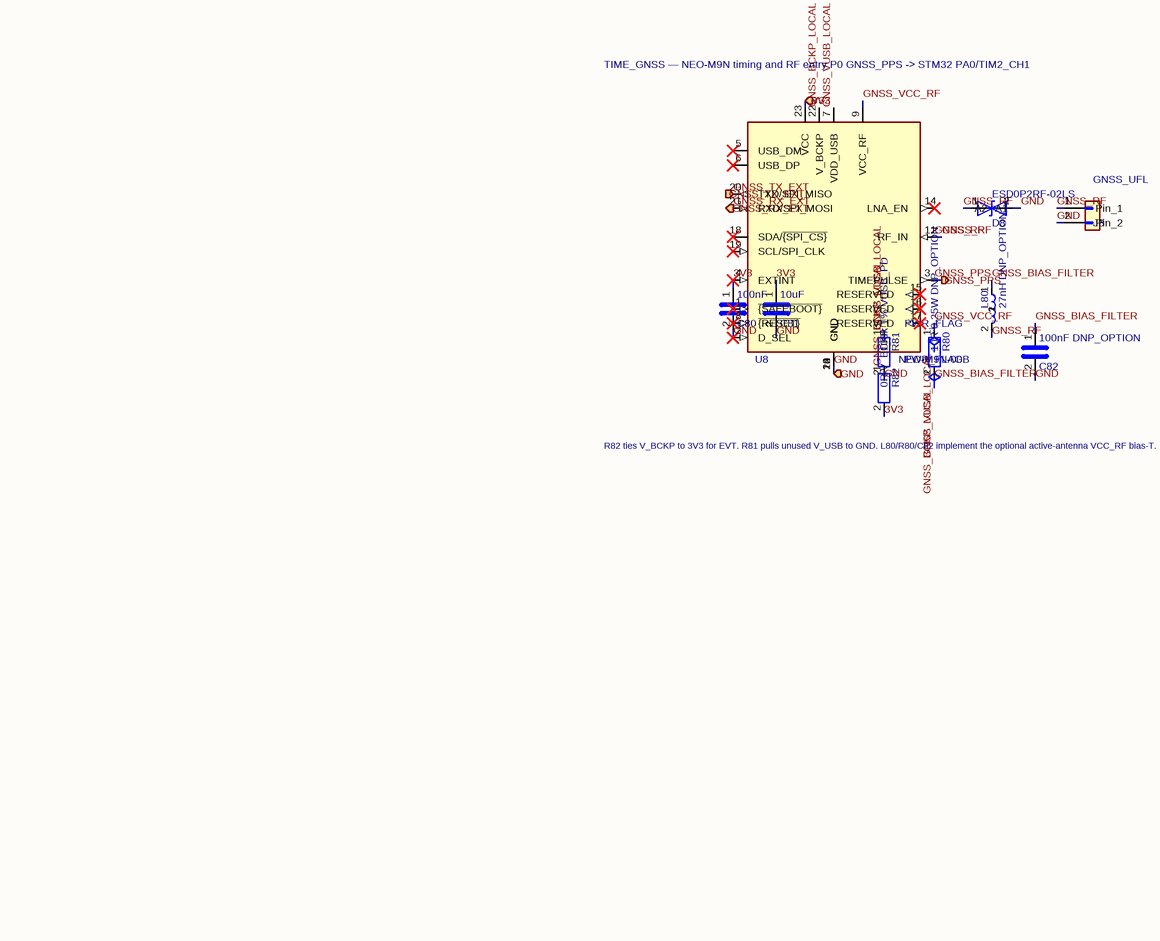
[diagram p6: 30_TIME_GNSS.SchDoc]

### Parts
#FLG0301  PWR_FLAG  (graphical)
#FLG0302  PWR_FLAG  (graphical)
C80  100nF  [C_0402_1005Metric]
C81  10uF  [C_0805_2012Metric]
C82  100nF DNP_OPTION  [C_0402_1005Metric]
D8  ESD0P2RF-02LS  [ESD0P2RF-02LS_PG-TSSLP-2-1]
J8  GNSS_UFL  [Hirose_UFL_R_SMT_K]
L80  27nH DNP_OPTION  [L_0402_1005Metric]
R80  10R 0.25W DNP_OPTION  [R_0805_2012Metric]
R81  100k 1% VUSB_PD  [R_0603_1608Metric]
R82  0R V_BCKP  [R_0603_1608Metric]
U8  NEO-M9N-00B  [NEO-M9N_LCC24_12.2x16mm]

### Ports
3V3 (in), GND, GNSS_PPS (out), GNSS_RX_EXT (in), GNSS_TX_EXT (out)

### Nets
3V3: C80.1 C81.1 R82.2 U8.4(EXTINT) U8.23(VCC) ; port 3V3
GND: C80.2 C81.2 C82.2 D8.2(A2) J8.2(Pin_2) R81.2 U8.2(D_SEL) U8.10(GND) U8.12(GND) U8.13(GND) U8.24(GND) ; port GND
GNSS_BCKP_LOCAL: #FLG0301.1 R82.1 U8.22(V_BCKP)
GNSS_BIAS_FILTER: C82.1 L80.1 R80.2
GNSS_PPS: U8.3(TIMEPULSE) ; port GNSS_PPS
GNSS_RF: D8.1(A1) J8.1(Pin_1) L80.2 U8.11(RF_IN)
GNSS_RX_EXT: U8.21(RXD/SPI_MOSI) ; port GNSS_RX_EXT
GNSS_TX_EXT: U8.20(TXD/SPI_MISO) ; port GNSS_TX_EXT
GNSS_VCC_RF: R80.1 U8.9(VCC_RF)
GNSS_VUSB_LOCAL: #FLG0302.1 R81.1 U8.7(VDD_USB)

Not connected (* = marked no-connect by the designer): U8 1(~{{SAFEBOOT}})* 5(USB_DM)* 6(USB_DP)* 8(~{{RESET}})* 14(LNA_EN)* 15(RESERVED)* 16(RESERVED)* 17(RESERVED)* 18(SDA/~{{SPI_CS}})* 19(SCL/SPI_CLK)*

### Notes on the sheet
- (near U8) TIME_GNSS — NEO-M9N timing and RF entry
  P0 GNSS_PPS -> STM32 PA0/TIM2_CH1
- R82 ties V_BCKP to 3V3 for EVT. R81 pulls unused V_USB to GND.
  L80/R80/C82 implement the optional active-antenna VCC_RF bias-T.
- 1
- 2
- 3
- 4
- 5
- 6
- A
- B
- C
- D
- Title: EVT_SYS_CARRIER
- File: 30_TIME_GNSS.kicad_sch
- Sheet: /
- KiCad E.D.A.  kicad (5.1.4)-1
- Size: A4
- Date:
- Rev:
- Id: 1/1

### Library data of the parts
#FLG0301 #FLG0302 = PWR_FLAG: hierarchy_path: /6b16e5b2-f68a-4a25-ac1d-30b3be7dfe00/cfcf9ef4-55fe-4144-92de-daa9aa4ce54a; Value: PWR_FLAG
C80 C82 = C: MPN: 100nF_16V_X7R; hierarchy_path: /6b16e5b2-f68a-4a25-ac1d-30b3be7dfe00/cfcf9ef4-55fe-4144-92de-daa9aa4ce54a; Footprint: Capacitor_SMD:C_0402_1005Metric
  C80: Value: 100nF
  C82: Value: 100nF DNP_OPTION
C81 = C: MPN: 10uF_6.3V_X7R; hierarchy_path: /6b16e5b2-f68a-4a25-ac1d-30b3be7dfe00/cfcf9ef4-55fe-4144-92de-daa9aa4ce54a; Value: 10uF; Footprint: Capacitor_SMD:C_0805_2012Metric
D8 = D_TVS: hierarchy_path: /6b16e5b2-f68a-4a25-ac1d-30b3be7dfe00/cfcf9ef4-55fe-4144-92de-daa9aa4ce54a; MPN: ESD0P2RF-02LS; Value: ESD0P2RF-02LS; Footprint: SystemCarrier_Local:ESD0P2RF-02LS_PG-TSSLP-2-1
J8 = Conn_01x02: MPN: U.FL-R-SMT-K(800); hierarchy_path: /6b16e5b2-f68a-4a25-ac1d-30b3be7dfe00/cfcf9ef4-55fe-4144-92de-daa9aa4ce54a; Value: GNSS_UFL; Footprint: SystemCarrier_Altium:Hirose_UFL_R_SMT_K
L80 = L: MPN: 27nH_0402; hierarchy_path: /6b16e5b2-f68a-4a25-ac1d-30b3be7dfe00/cfcf9ef4-55fe-4144-92de-daa9aa4ce54a; Value: 27nH DNP_OPTION; Footprint: Inductor_SMD:L_0402_1005Metric
R80 = R: MPN: 10R_0.25W; hierarchy_path: /6b16e5b2-f68a-4a25-ac1d-30b3be7dfe00/cfcf9ef4-55fe-4144-92de-daa9aa4ce54a; Value: 10R 0.25W DNP_OPTION; Footprint: Resistor_SMD:R_0805_2012Metric
R81 = R: MPN: 100k_1%; hierarchy_path: /6b16e5b2-f68a-4a25-ac1d-30b3be7dfe00/cfcf9ef4-55fe-4144-92de-daa9aa4ce54a; Value: 100k 1% VUSB_PD; Footprint: Resistor_SMD:R_0603_1608Metric
R82 = R: hierarchy_path: /6b16e5b2-f68a-4a25-ac1d-30b3be7dfe00/cfcf9ef4-55fe-4144-92de-daa9aa4ce54a; MPN: 0R; Value: 0R V_BCKP; Footprint: Resistor_SMD:R_0603_1608Metric
U8 = NEO-M9N: hierarchy_path: /6b16e5b2-f68a-4a25-ac1d-30b3be7dfe00/cfcf9ef4-55fe-4144-92de-daa9aa4ce54a; MPN: NEO-M9N-00B; Value: NEO-M9N-00B; Footprint: SystemCarrier_Local:NEO-M9N_LCC24_12.2x16mm

## Sheet 40_IMU.SchDoc
size 297 x 209 mm
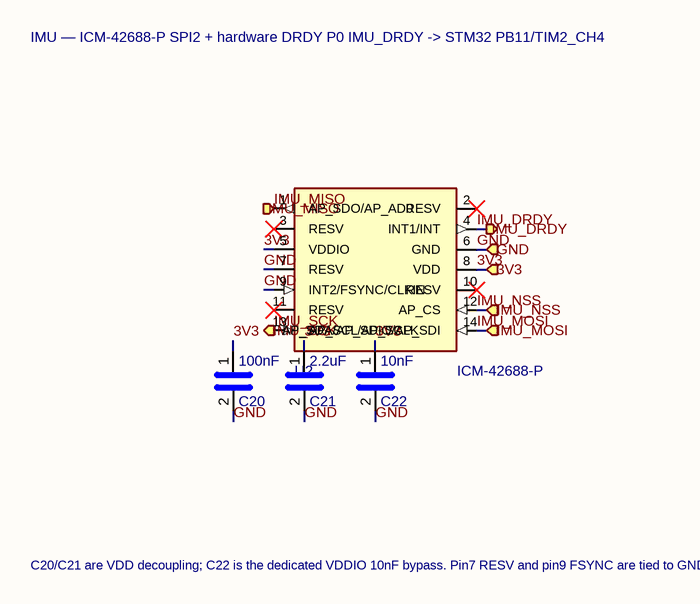
[diagram p7: 40_IMU.SchDoc]

### Parts
C20  100nF  [C_0402_1005Metric]
C21  2.2uF  [C_0603_1608Metric]
C22  10nF  [C_0402_1005Metric]
U2  ICM-42688-P  [ICM-42688-P_LGA14_2.5x3mm_P0.5mm]

### Ports
3V3 (in), GND, IMU_DRDY (out), IMU_MISO (out), IMU_MOSI (in), IMU_NSS (in), IMU_SCK (in)

### Nets
3V3: C20.1 C21.1 C22.1 U2.5(VDDIO) U2.8(VDD) ; port 3V3
GND: C20.2 C21.2 C22.2 U2.6(GND) U2.7(RESV) U2.9(INT2/FSYNC/CLKIN) ; port GND
IMU_DRDY: U2.4(INT1/INT) ; port IMU_DRDY
IMU_MISO: U2.1(AP_SDO/AP_AD0) ; port IMU_MISO
IMU_MOSI: U2.14(AP_SDA/AP_SDIO/AP_SDI) ; port IMU_MOSI
IMU_NSS: U2.12(AP_CS) ; port IMU_NSS
IMU_SCK: U2.13(AP_SCL/AP_SCLK) ; port IMU_SCK

Not connected (* = marked no-connect by the designer): U2 2(RESV)* 3(RESV)* 10(RESV)* 11(RESV)*

### Notes on the sheet
- IMU — ICM-42688-P SPI2 + hardware DRDY
  P0 IMU_DRDY -> STM32 PB11/TIM2_CH4
- C20/C21 are VDD decoupling; C22 is the dedicated VDDIO 10nF bypass.
  Pin7 RESV and pin9 FSYNC are tied to GND per the Rev.A pin contract.
- 1
- 2
- 3
- 4
- 5
- 6
- A
- B
- C
- D
- Title: EVT_SYS_CARRIER
- File: 40_IMU.kicad_sch
- Sheet: /
- KiCad E.D.A.  kicad (5.1.4)-1
- Size: A4
- Date:
- Rev:
- Id: 1/1

### Library data of the parts
C20 = C: MPN: 100nF_6.3V_X7R; hierarchy_path: /6b16e5b2-f68a-4a25-ac1d-30b3be7dfe00/183292f2-075b-4c7f-ad1e-cc5562ab3d8e; Value: 100nF; Footprint: Capacitor_SMD:C_0402_1005Metric
C21 = C: MPN: 2.2uF_6.3V_X7R; hierarchy_path: /6b16e5b2-f68a-4a25-ac1d-30b3be7dfe00/183292f2-075b-4c7f-ad1e-cc5562ab3d8e; Value: 2.2uF; Footprint: Capacitor_SMD:C_0603_1608Metric
C22 = C: MPN: 10nF_6.3V_X7R; hierarchy_path: /6b16e5b2-f68a-4a25-ac1d-30b3be7dfe00/183292f2-075b-4c7f-ad1e-cc5562ab3d8e; Value: 10nF; Footprint: Capacitor_SMD:C_0402_1005Metric
U2 = ICM-42688-P: Capture_Status: LOCAL_CONTRACT_SYMBOL; hierarchy_path: /6b16e5b2-f68a-4a25-ac1d-30b3be7dfe00/183292f2-075b-4c7f-ad1e-cc5562ab3d8e; MPN: ICM-42688-P; Value: ICM-42688-P; Footprint: SystemCarrier_Local:ICM-42688-P_LGA14_2.5x3mm_P0.5mm

## Sheet 50_RADAR_IO_CAN.SchDoc
size 297 x 209 mm
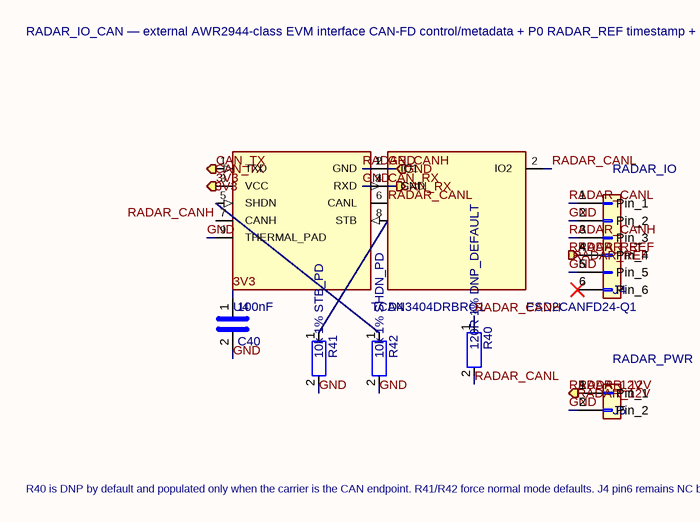
[diagram p8: 50_RADAR_IO_CAN.SchDoc]

### Parts
C40  100nF  [C_0402_1005Metric]
D4  ESD2CANFD24-Q1  [SOT-23]
J4  RADAR_IO  [Molex_43045-0600_RA_THT_6P]
J5  RADAR_PWR  [Molex_43650-0200_RA_THT_2P]
R40  120R 1% DNP_DEFAULT  [R_0603_1608Metric]
R41  10k 1% STB_PD  [R_0603_1608Metric]
R42  10k 1% SHDN_PD  [R_0603_1608Metric]
U4  TCAN3404DRBRQ1  [Texas_DRB0008A]

### Ports
3V3 (in), CAN_RX (out), CAN_TX (in), GND, RADAR_12V (in), RADAR_REF (out)

### Nets
3V3: C40.1 U4.3(VCC) ; port 3V3
CAN_RX: U4.4(RXD) ; port CAN_RX
CAN_TX: U4.1(TXD) ; port CAN_TX
GND: C40.2 D4.3(GND) J4.2(Pin_2) J4.5(Pin_5) J5.2(Pin_2) R41.2 R42.2 U4.2(GND) U4.9(THERMAL_PAD) ; port GND
RADAR_12V: J5.1(Pin_1) ; port RADAR_12V
RADAR_CANH: D4.1(IO1) J4.3(Pin_3) R40.1 U4.7(CANH)
RADAR_CANL: D4.2(IO2) J4.1(Pin_1) R40.2 U4.6(CANL)
RADAR_REF: J4.4(Pin_4) ; port RADAR_REF
NetR41_1: R41.1 U4.8(STB)
NetR42_1: R42.1 U4.5(SHDN)

Not connected (* = marked no-connect by the designer): J4 6(Pin_6)*

### Notes on the sheet
- RADAR_IO_CAN — external AWR2944-class EVM interface
  CAN-FD control/metadata + P0 RADAR_REF timestamp + protected 12V
- R40 is DNP by default and populated only when the carrier is the CAN endpoint.
  R41/R42 force normal mode defaults. J4 pin6 remains NC by Rev.A contract.
- 1
- 2
- 3
- 4
- 5
- 6
- A
- B
- C
- D
- Title: EVT_SYS_CARRIER
- File: 50_RADAR_IO_CAN.kicad_sch
- Sheet: /
- KiCad E.D.A.  kicad (5.1.4)-1
- Size: A4
- Date:
- Rev:
- Id: 1/1

### Library data of the parts
C40 = C: MPN: 100nF_6.3V_X7R; hierarchy_path: /6b16e5b2-f68a-4a25-ac1d-30b3be7dfe00/68e57c4d-9c3e-4696-bb37-04404f48f928; Value: 100nF; Footprint: Capacitor_SMD:C_0402_1005Metric
D4 = ESD2CANFD24DBZRQ1: Capture_Status: LOCAL_CONTRACT_SYMBOL; hierarchy_path: /6b16e5b2-f68a-4a25-ac1d-30b3be7dfe00/68e57c4d-9c3e-4696-bb37-04404f48f928; MPN: ESD2CANFD24DBZRQ1; Value: ESD2CANFD24-Q1; Footprint: Package_TO_SOT_SMD:SOT-23
J4 = Conn_01x06: MPN: 43045-0600; hierarchy_path: /6b16e5b2-f68a-4a25-ac1d-30b3be7dfe00/68e57c4d-9c3e-4696-bb37-04404f48f928; Value: RADAR_IO; Footprint: SystemCarrier_Altium:Molex_43045-0600_RA_THT_6P
J5 = Conn_01x02: MPN: 43650-0200; hierarchy_path: /6b16e5b2-f68a-4a25-ac1d-30b3be7dfe00/68e57c4d-9c3e-4696-bb37-04404f48f928; Value: RADAR_PWR; Footprint: SystemCarrier_Altium:Molex_43650-0200_RA_THT_2P
R40 = R: MPN: 120R_1%; hierarchy_path: /6b16e5b2-f68a-4a25-ac1d-30b3be7dfe00/68e57c4d-9c3e-4696-bb37-04404f48f928; Value: 120R 1% DNP_DEFAULT; Footprint: Resistor_SMD:R_0603_1608Metric
R41 R42 = R: MPN: 10k_1%; hierarchy_path: /6b16e5b2-f68a-4a25-ac1d-30b3be7dfe00/68e57c4d-9c3e-4696-bb37-04404f48f928; Footprint: Resistor_SMD:R_0603_1608Metric
  R41: Value: 10k 1% STB_PD
  R42: Value: 10k 1% SHDN_PD
U4 = TCAN3404DRBRQ1: Capture_Status: LOCAL_CONTRACT_SYMBOL; hierarchy_path: /6b16e5b2-f68a-4a25-ac1d-30b3be7dfe00/68e57c4d-9c3e-4696-bb37-04404f48f928; MPN: TCAN3404DRBRQ1; Value: TCAN3404DRBRQ1; Footprint: Package_DFN_QFN:Texas_DRB0008A

## Sheet 60_ETHERNET.SchDoc
size 297 x 209 mm
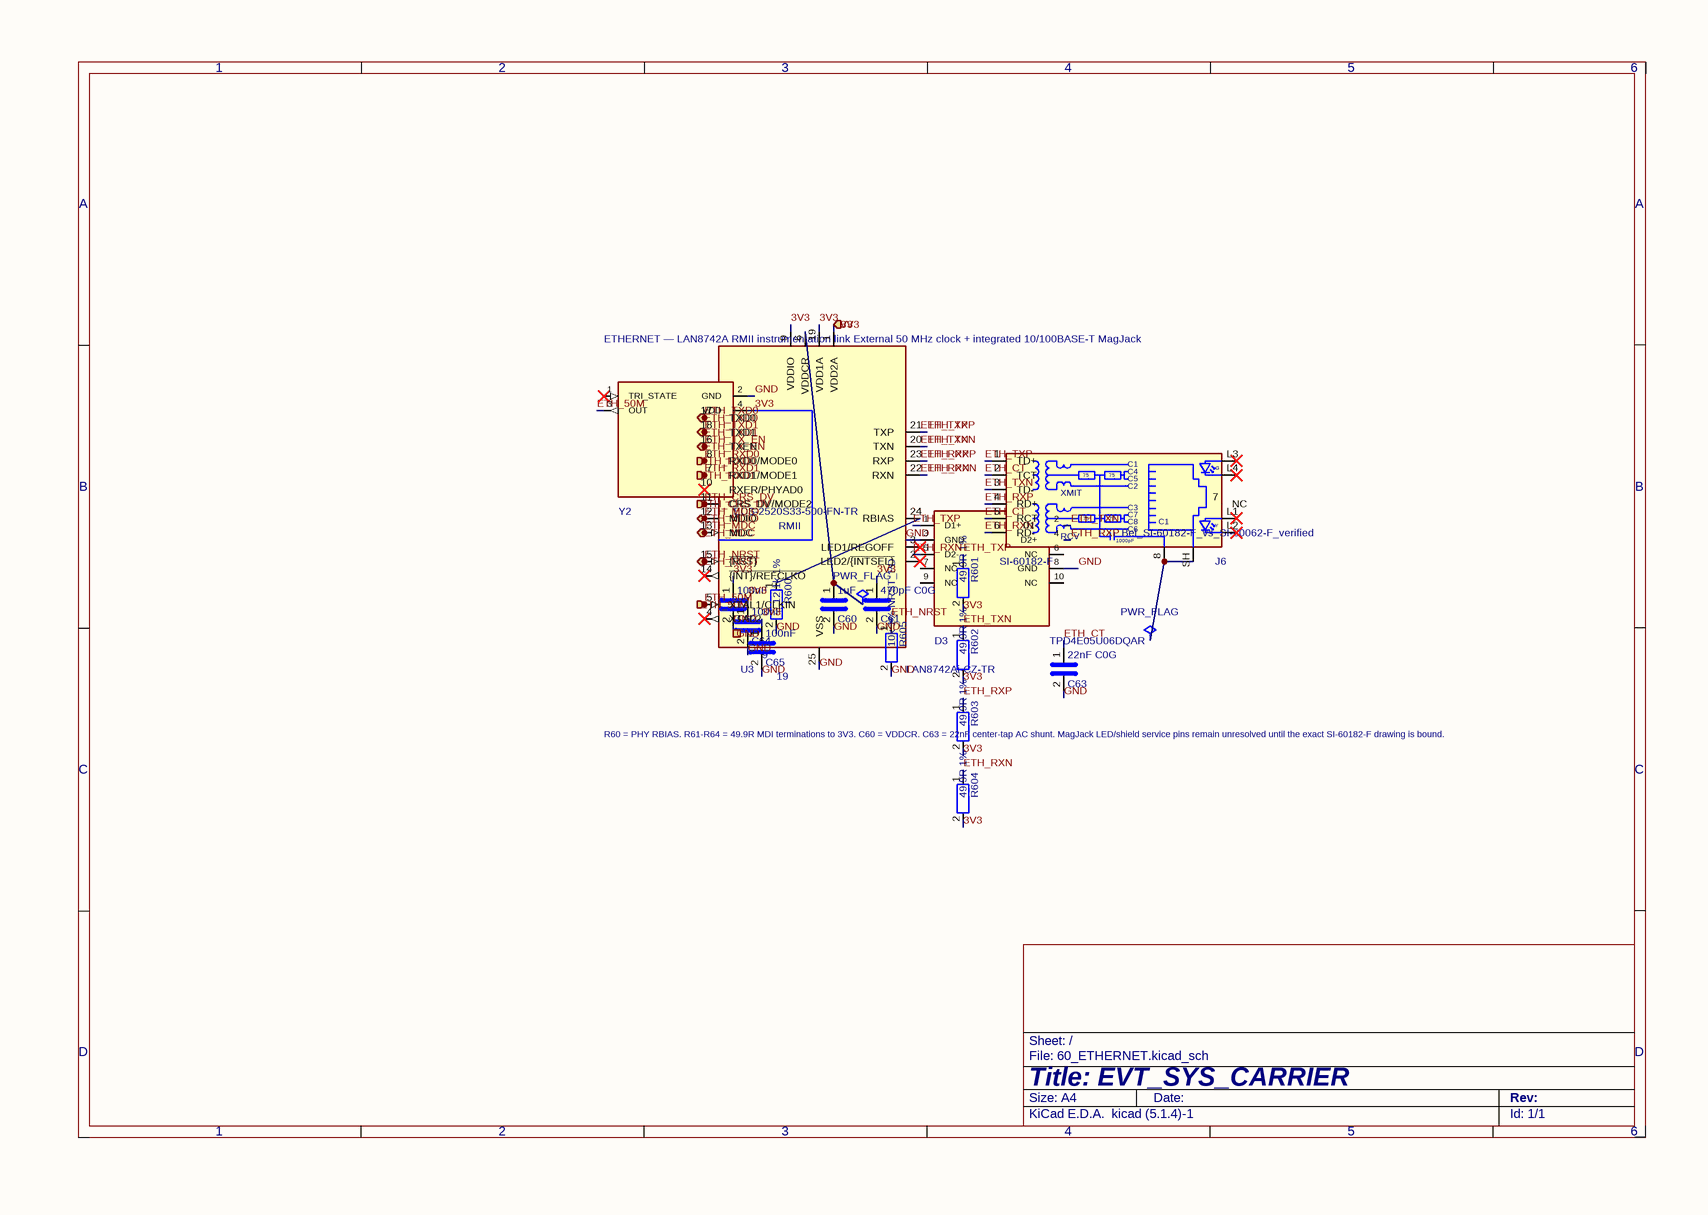
[diagram p9: 60_ETHERNET.SchDoc]

### Parts
#FLG0601  PWR_FLAG  (graphical)
#FLG0602  PWR_FLAG  (graphical)
C60  1uF  [C_0603_1608Metric]
C61  470pF C0G  [C_0402_1005Metric]
C62  Decouples_U3_Pin: 1  [C_0402_1005Metric]  (hidden comment: 100nF)
C63  22nF C0G  [C_0603_1608Metric]
C64  Decouples_U3_Pin: 9  [C_0402_1005Metric]  (hidden comment: 100nF)
C65  Decouples_U3_Pin: 19  [C_0402_1005Metric]  (hidden comment: 100nF)
D3  TPD4E05U06DQAR  [USON-10_2.5x1.0mm_P0.5mm]
J6  Compatibility_Basis: Bel_SI-60182-F_vs_SI-60062-F_verified  [RJ45_Bel_SI-60062-F]  (hidden comment: SI-60182-F)
R600  12.1k 1%  [R_0603_1608Metric]
R601  49.9R 1%  [R_0402_1005Metric]
R602  49.9R 1%  [R_0402_1005Metric]
R603  49.9R 1%  [R_0402_1005Metric]
R604  49.9R 1%  [R_0402_1005Metric]
R605  10k 1% NRST_PD  [R_0603_1608Metric]
U3  LAN8742Ai-CZ-TR  [QFN-24-1EP_4x4mm_P0.5mm_EP2.6x2.6mm]
Y2  ECS-2520S33-500-FN-TR  [Oscillator_SMD_ECS_2520MV-xxx-xx-4Pin_2.5x2.0mm]

### Ports
3V3 (in), ETH_50M (out), ETH_CRS_DV (out), ETH_MDC (in), ETH_MDIO (bidir), ETH_NRST (in), ETH_RXD0 (out), ETH_RXD1 (out), ETH_TX_EN (in), ETH_TXD0 (in), ETH_TXD1 (in), GND

### Nets
3V3: C61.1 C62.1 C64.1 C65.1 R601.2 R602.2 R603.2 R604.2 U3.1(VDD2A) U3.9(VDDIO) U3.19(VDD1A) Y2.4(VDD) ; port 3V3
ETH_50M: U3.5(XTAL1/CLKIN) Y2.3(OUT) ; port ETH_50M
ETH_CRS_DV: U3.11(CRS_DV/MODE2) ; port ETH_CRS_DV
ETH_CT: C63.1 J6.2(TCT) J6.5(RCT)
ETH_MDC: U3.13(MDC) ; port ETH_MDC
ETH_MDIO: U3.12(MDIO) ; port ETH_MDIO
ETH_NRST: R605.1 U3.15(~{{RST}}) ; port ETH_NRST
ETH_RXD0: U3.8(RXD0/MODE0) ; port ETH_RXD0
ETH_RXD1: U3.7(RXD1/MODE1) ; port ETH_RXD1
ETH_RXN: D3.5(D2-) J6.6(RD-) R604.1 U3.22(RXN)
ETH_RXP: D3.4(D2+) J6.4(RD+) R603.1 U3.23(RXP)
ETH_TX_EN: U3.16(TXEN) ; port ETH_TX_EN
ETH_TXD0: U3.17(TXD0) ; port ETH_TXD0
ETH_TXD1: U3.18(TXD1) ; port ETH_TXD1
ETH_TXN: D3.2(D1-) J6.3(TD-) R602.1 U3.20(TXN)
ETH_TXP: D3.1(D1+) J6.1(TD+) R601.1 U3.21(TXP)
GND: C60.2 C61.2 C62.2 C63.2 C64.2 C65.2 D3.3(GND) D3.8(GND) R600.2 R605.2 U3.25(VSS) Y2.2(GND) ; port GND
Net#FLG0601_1: #FLG0601.1 C60.1 U3.6(VDDCR)
Net#FLG0602_1: #FLG0602.1 J6.8 J6.SH
NetR600_1: R600.1 U3.24(RBIAS)

Not connected (* = marked no-connect by the designer): D3 6(NC) 7(NC) 9(NC) 10(NC); J6 7(NC) L1* L2* L3* L4*; U3 2(LED2/~{{INTSEL}})* 3(LED1/REGOFF)* 4(XTAL2)* 10(RXER/PHYAD0)* 14(~{{INT}/REFCLKO})*; Y2 1(TRI_STATE)*

### Notes on the sheet
- (near U3) ETHERNET — LAN8742A RMII instrumentation link
  External 50 MHz clock + integrated 10/100BASE-T MagJack
- (near R603) R60 = PHY RBIAS. R61-R64 = 49.9R MDI terminations to 3V3.
  C60 = VDDCR. C63 = 22nF center-tap AC shunt.
  MagJack LED/shield service pins remain unresolved until the exact SI-60182-F drawing is bound.
- 1
- 2
- 3
- 4
- 5
- 6
- A
- B
- C
- D
- Title: EVT_SYS_CARRIER
- File: 60_ETHERNET.kicad_sch
- Sheet: /
- KiCad E.D.A.  kicad (5.1.4)-1
- Size: A4
- Date:
- Rev:
- Id: 1/1
- (in symbol LAN8742A) RMII
- (in symbol RJ45_Bel_SI-60062-F) C1; G; 75; C4; C5; XMIT; C2; C3; C8; C7; Y; RCV; C6; 1000pF

### Library data of the parts
#FLG0601 #FLG0602 = PWR_FLAG: hierarchy_path: /6b16e5b2-f68a-4a25-ac1d-30b3be7dfe00/7941ba62-a644-479f-a1c8-d088a5eb6083; Value: PWR_FLAG
C60 = C: MPN: 1uF_6.3V_X7R; hierarchy_path: /6b16e5b2-f68a-4a25-ac1d-30b3be7dfe00/7941ba62-a644-479f-a1c8-d088a5eb6083; Value: 1uF; Footprint: Capacitor_SMD:C_0603_1608Metric
C61 = C: MPN: 470pF_C0G; hierarchy_path: /6b16e5b2-f68a-4a25-ac1d-30b3be7dfe00/7941ba62-a644-479f-a1c8-d088a5eb6083; Value: 470pF C0G; Footprint: Capacitor_SMD:C_0402_1005Metric
C62 C64 C65 = C: MPN: 100nF_6.3V_X7R; hierarchy_path: /6b16e5b2-f68a-4a25-ac1d-30b3be7dfe00/7941ba62-a644-479f-a1c8-d088a5eb6083; Value: 100nF; Footprint: Capacitor_SMD:C_0402_1005Metric
C63 = C: MPN: 22nF_C0G; hierarchy_path: /6b16e5b2-f68a-4a25-ac1d-30b3be7dfe00/7941ba62-a644-479f-a1c8-d088a5eb6083; Value: 22nF C0G; Footprint: Capacitor_SMD:C_0603_1608Metric
D3 = TPD4E05U06DQAR: Capture_Status: LOCAL_CONTRACT_SYMBOL; hierarchy_path: /6b16e5b2-f68a-4a25-ac1d-30b3be7dfe00/7941ba62-a644-479f-a1c8-d088a5eb6083; MPN: TPD4E05U06DQAR; Value: TPD4E05U06DQAR; Footprint: Package_SON:USON-10_2.5x1.0mm_P0.5mm
J6 = RJ45_Bel_SI-60062-F: hierarchy_path: /6b16e5b2-f68a-4a25-ac1d-30b3be7dfe00/7941ba62-a644-479f-a1c8-d088a5eb6083; MPN: SI-60182-F; Value: SI-60182-F; Footprint: Connector_RJ:RJ45_Bel_SI-60062-F
R600 = R: MPN: 12.1k_1%; hierarchy_path: /6b16e5b2-f68a-4a25-ac1d-30b3be7dfe00/7941ba62-a644-479f-a1c8-d088a5eb6083; Value: 12.1k 1%; Footprint: Resistor_SMD:R_0603_1608Metric
R601-R604 = R: MPN: 49.9R_1%; hierarchy_path: /6b16e5b2-f68a-4a25-ac1d-30b3be7dfe00/7941ba62-a644-479f-a1c8-d088a5eb6083; Value: 49.9R 1%; Footprint: Resistor_SMD:R_0402_1005Metric
R605 = R: MPN: 10k_1%; hierarchy_path: /6b16e5b2-f68a-4a25-ac1d-30b3be7dfe00/7941ba62-a644-479f-a1c8-d088a5eb6083; Value: 10k 1% NRST_PD; Footprint: Resistor_SMD:R_0603_1608Metric
U3 = LAN8742A: hierarchy_path: /6b16e5b2-f68a-4a25-ac1d-30b3be7dfe00/7941ba62-a644-479f-a1c8-d088a5eb6083; MPN: LAN8742Ai-CZ-TR; Value: LAN8742Ai-CZ-TR; Footprint: Package_DFN_QFN:QFN-24-1EP_4x4mm_P0.5mm_EP2.6x2.6mm
Y2 = ECS-2520S33-500-FN-TR: Capture_Status: LOCAL_CONTRACT_SYMBOL; hierarchy_path: /6b16e5b2-f68a-4a25-ac1d-30b3be7dfe00/7941ba62-a644-479f-a1c8-d088a5eb6083; MPN: ECS-2520S33-500-FN-TR; Value: ECS-2520S33-500-FN-TR; Footprint: Oscillator:Oscillator_SMD_ECS_2520MV-xxx-xx-4Pin_2.5x2.0mm

## Sheet 70_DEBUG_BOOT.SchDoc
size 297 x 209 mm
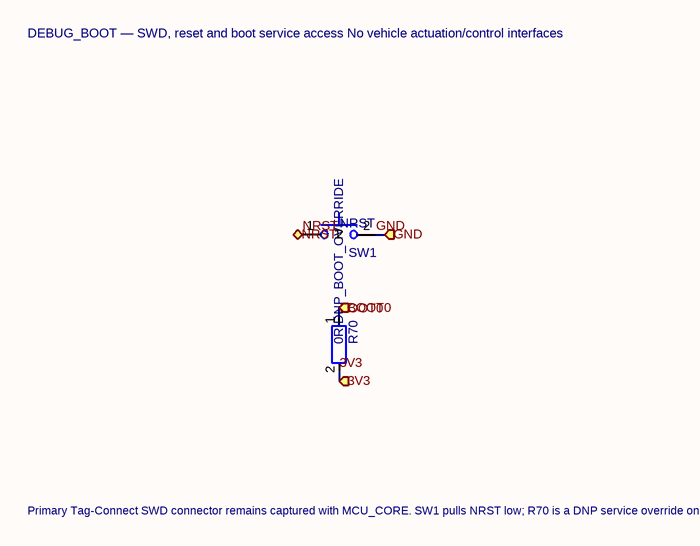
[diagram p10: 70_DEBUG_BOOT.SchDoc]

### Parts
R70  0R DNP_BOOT_OVERRIDE  [R_0603_1608Metric]
SW1  NRST  [ESwitch_TL3301_GullWing_6x6]

### Ports
3V3 (in), BOOT0, GND, NRST (bidir)

### Nets
3V3: R70.2 ; port 3V3
BOOT0: R70.1 ; port BOOT0
GND: SW1.2 ; port GND
NRST: SW1.1 ; port NRST

### Notes on the sheet
- DEBUG_BOOT — SWD, reset and boot service access
  No vehicle actuation/control interfaces
- Primary Tag-Connect SWD connector remains captured with MCU_CORE.
  SW1 pulls NRST low; R70 is a DNP service override only.
- 1
- 2
- 3
- 4
- 5
- 6
- A
- B
- C
- D
- Title: EVT_SYS_CARRIER
- File: 70_DEBUG_BOOT.kicad_sch
- Sheet: /
- KiCad E.D.A.  kicad (5.1.4)-1
- Size: A4
- Date:
- Rev:
- Id: 1/1

### Library data of the parts
R70 = R: hierarchy_path: /6b16e5b2-f68a-4a25-ac1d-30b3be7dfe00/864bacf6-a919-4f56-8b6c-87e6b65d73c4; MPN: 0R; Value: 0R DNP_BOOT_OVERRIDE; Footprint: Resistor_SMD:R_0603_1608Metric
SW1 = SW_Push: MPN: TL3301NF160QG; hierarchy_path: /6b16e5b2-f68a-4a25-ac1d-30b3be7dfe00/864bacf6-a919-4f56-8b6c-87e6b65d73c4; Value: NRST; Footprint: SystemCarrier_Altium:ESwitch_TL3301_GullWing_6x6

## Nets that join several sheets
3V3: 10_POWER_INPUT (6 pins), 20_MCU_CORE (38 pins), 30_TIME_GNSS (5 pins), 40_IMU (5 pins), 50_RADAR_IO_CAN (C40.1 U4.3), 60_ETHERNET (12 pins), 70_DEBUG_BOOT (R70.2)
BOOT0: 20_MCU_CORE (R10.1 U1.166), 70_DEBUG_BOOT (R70.1)
CAN_RX: 20_MCU_CORE (U1.142), 50_RADAR_IO_CAN (U4.4)
CAN_TX: 20_MCU_CORE (U1.143), 50_RADAR_IO_CAN (U4.1)
ETH_50M: 20_MCU_CORE (U1.41), 60_ETHERNET (U3.5 Y2.3)
ETH_CRS_DV: 20_MCU_CORE (U1.53), 60_ETHERNET (U3.11)
ETH_MDC: 20_MCU_CORE (U1.33), 60_ETHERNET (U3.13)
ETH_MDIO: 20_MCU_CORE (U1.42), 60_ETHERNET (U3.12)
ETH_NRST: 20_MCU_CORE (U1.3), 60_ETHERNET (R605.1 U3.15)
ETH_RXD0: 20_MCU_CORE (U1.54), 60_ETHERNET (U3.8)
ETH_RXD1: 20_MCU_CORE (U1.55), 60_ETHERNET (U3.7)
ETH_TX_EN: 20_MCU_CORE (U1.154), 60_ETHERNET (U3.16)
ETH_TXD0: 20_MCU_CORE (U1.156), 60_ETHERNET (U3.17)
ETH_TXD1: 20_MCU_CORE (U1.157), 60_ETHERNET (U3.18)
GND: 10_POWER_INPUT (20 pins), 20_MCU_CORE (39 pins), 30_TIME_GNSS (11 pins), 40_IMU (6 pins), 50_RADAR_IO_CAN (9 pins), 60_ETHERNET (12 pins), 70_DEBUG_BOOT (SW1.2)
GNSS_PPS: 20_MCU_CORE (U1.40), 30_TIME_GNSS (U8.3)
GNSS_RX_EXT: 20_MCU_CORE (U1.96), 30_TIME_GNSS (U8.21)
GNSS_TX_EXT: 20_MCU_CORE (U1.97), 30_TIME_GNSS (U8.20)
IMU_DRDY: 20_MCU_CORE (U1.80), 40_IMU (U2.4)
IMU_MISO: 20_MCU_CORE (U1.94), 40_IMU (U2.1)
IMU_MOSI: 20_MCU_CORE (U1.95), 40_IMU (U2.14)
IMU_NSS: 20_MCU_CORE (U1.92), 40_IMU (U2.12)
IMU_SCK: 20_MCU_CORE (U1.93), 40_IMU (U2.13)
NRST: 20_MCU_CORE (C115.1 U1.31), 70_DEBUG_BOOT (SW1.1)
RADAR_12V: 10_POWER_INPUT (U7.6), 50_RADAR_IO_CAN (J5.1)
RADAR_EFUSE_FLT: 10_POWER_INPUT (R7F.1 U7.4), 20_MCU_CORE (U1.2)
RADAR_REF: 20_MCU_CORE (U1.79), 50_RADAR_IO_CAN (J4.4)
SYS_EFUSE_FLT: 10_POWER_INPUT (R6F.1 U6.4), 20_MCU_CORE (U1.1)